# EasyEDA Pro project ProPrj_ROV_MINI_CTRL_2026-11-13.epro, schematic ROV_MINI_CTRL_V1.0.0

## Sheets
1 MCU: Assembly Variant: Basic; Board Name: Board1; Create Date: 2026-05-09; Page Name: MCU; Project Name: ROV_MINI_CTRL; Schematic Name: ROV_MINI_CTRL_V1.0.0; Update Date: 2026-05-09; Company: 嘉立创EDA; Page Size: A3; Version: V1.0
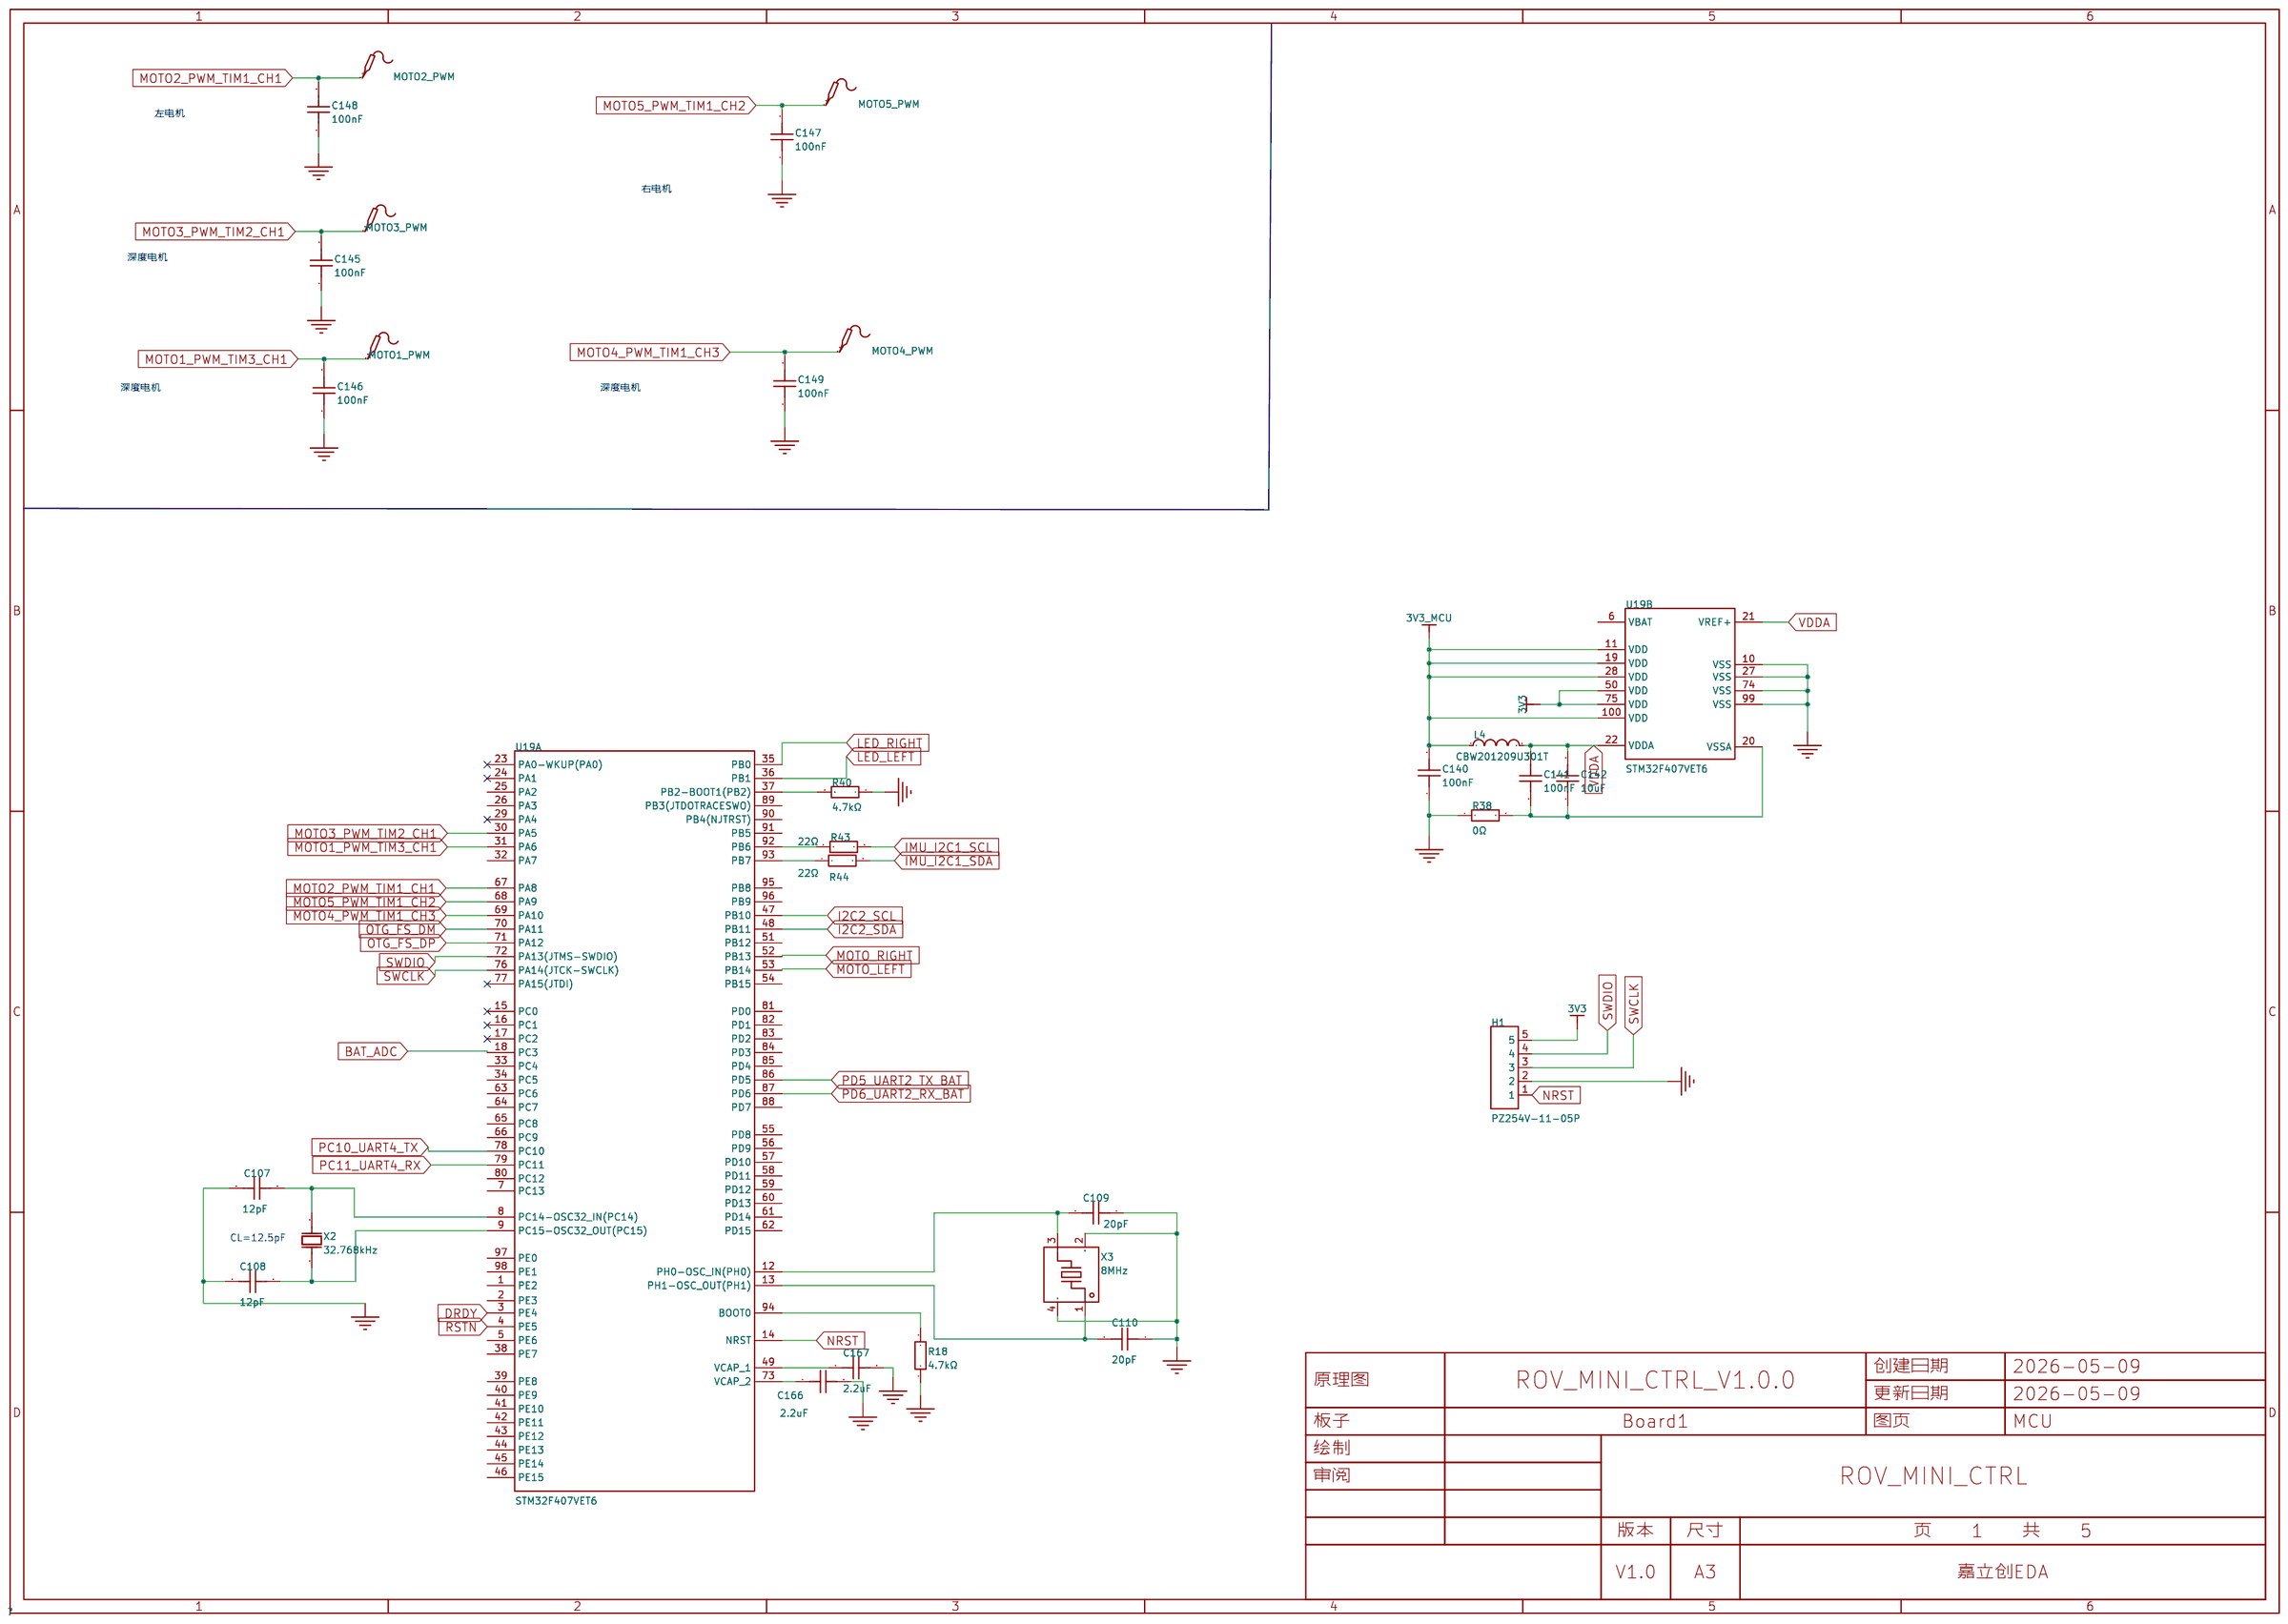
[diagram p7: MCU]
2 USB: Create Date: 2026-11-13; Page Name: USB; Update Date: 2026-11-13
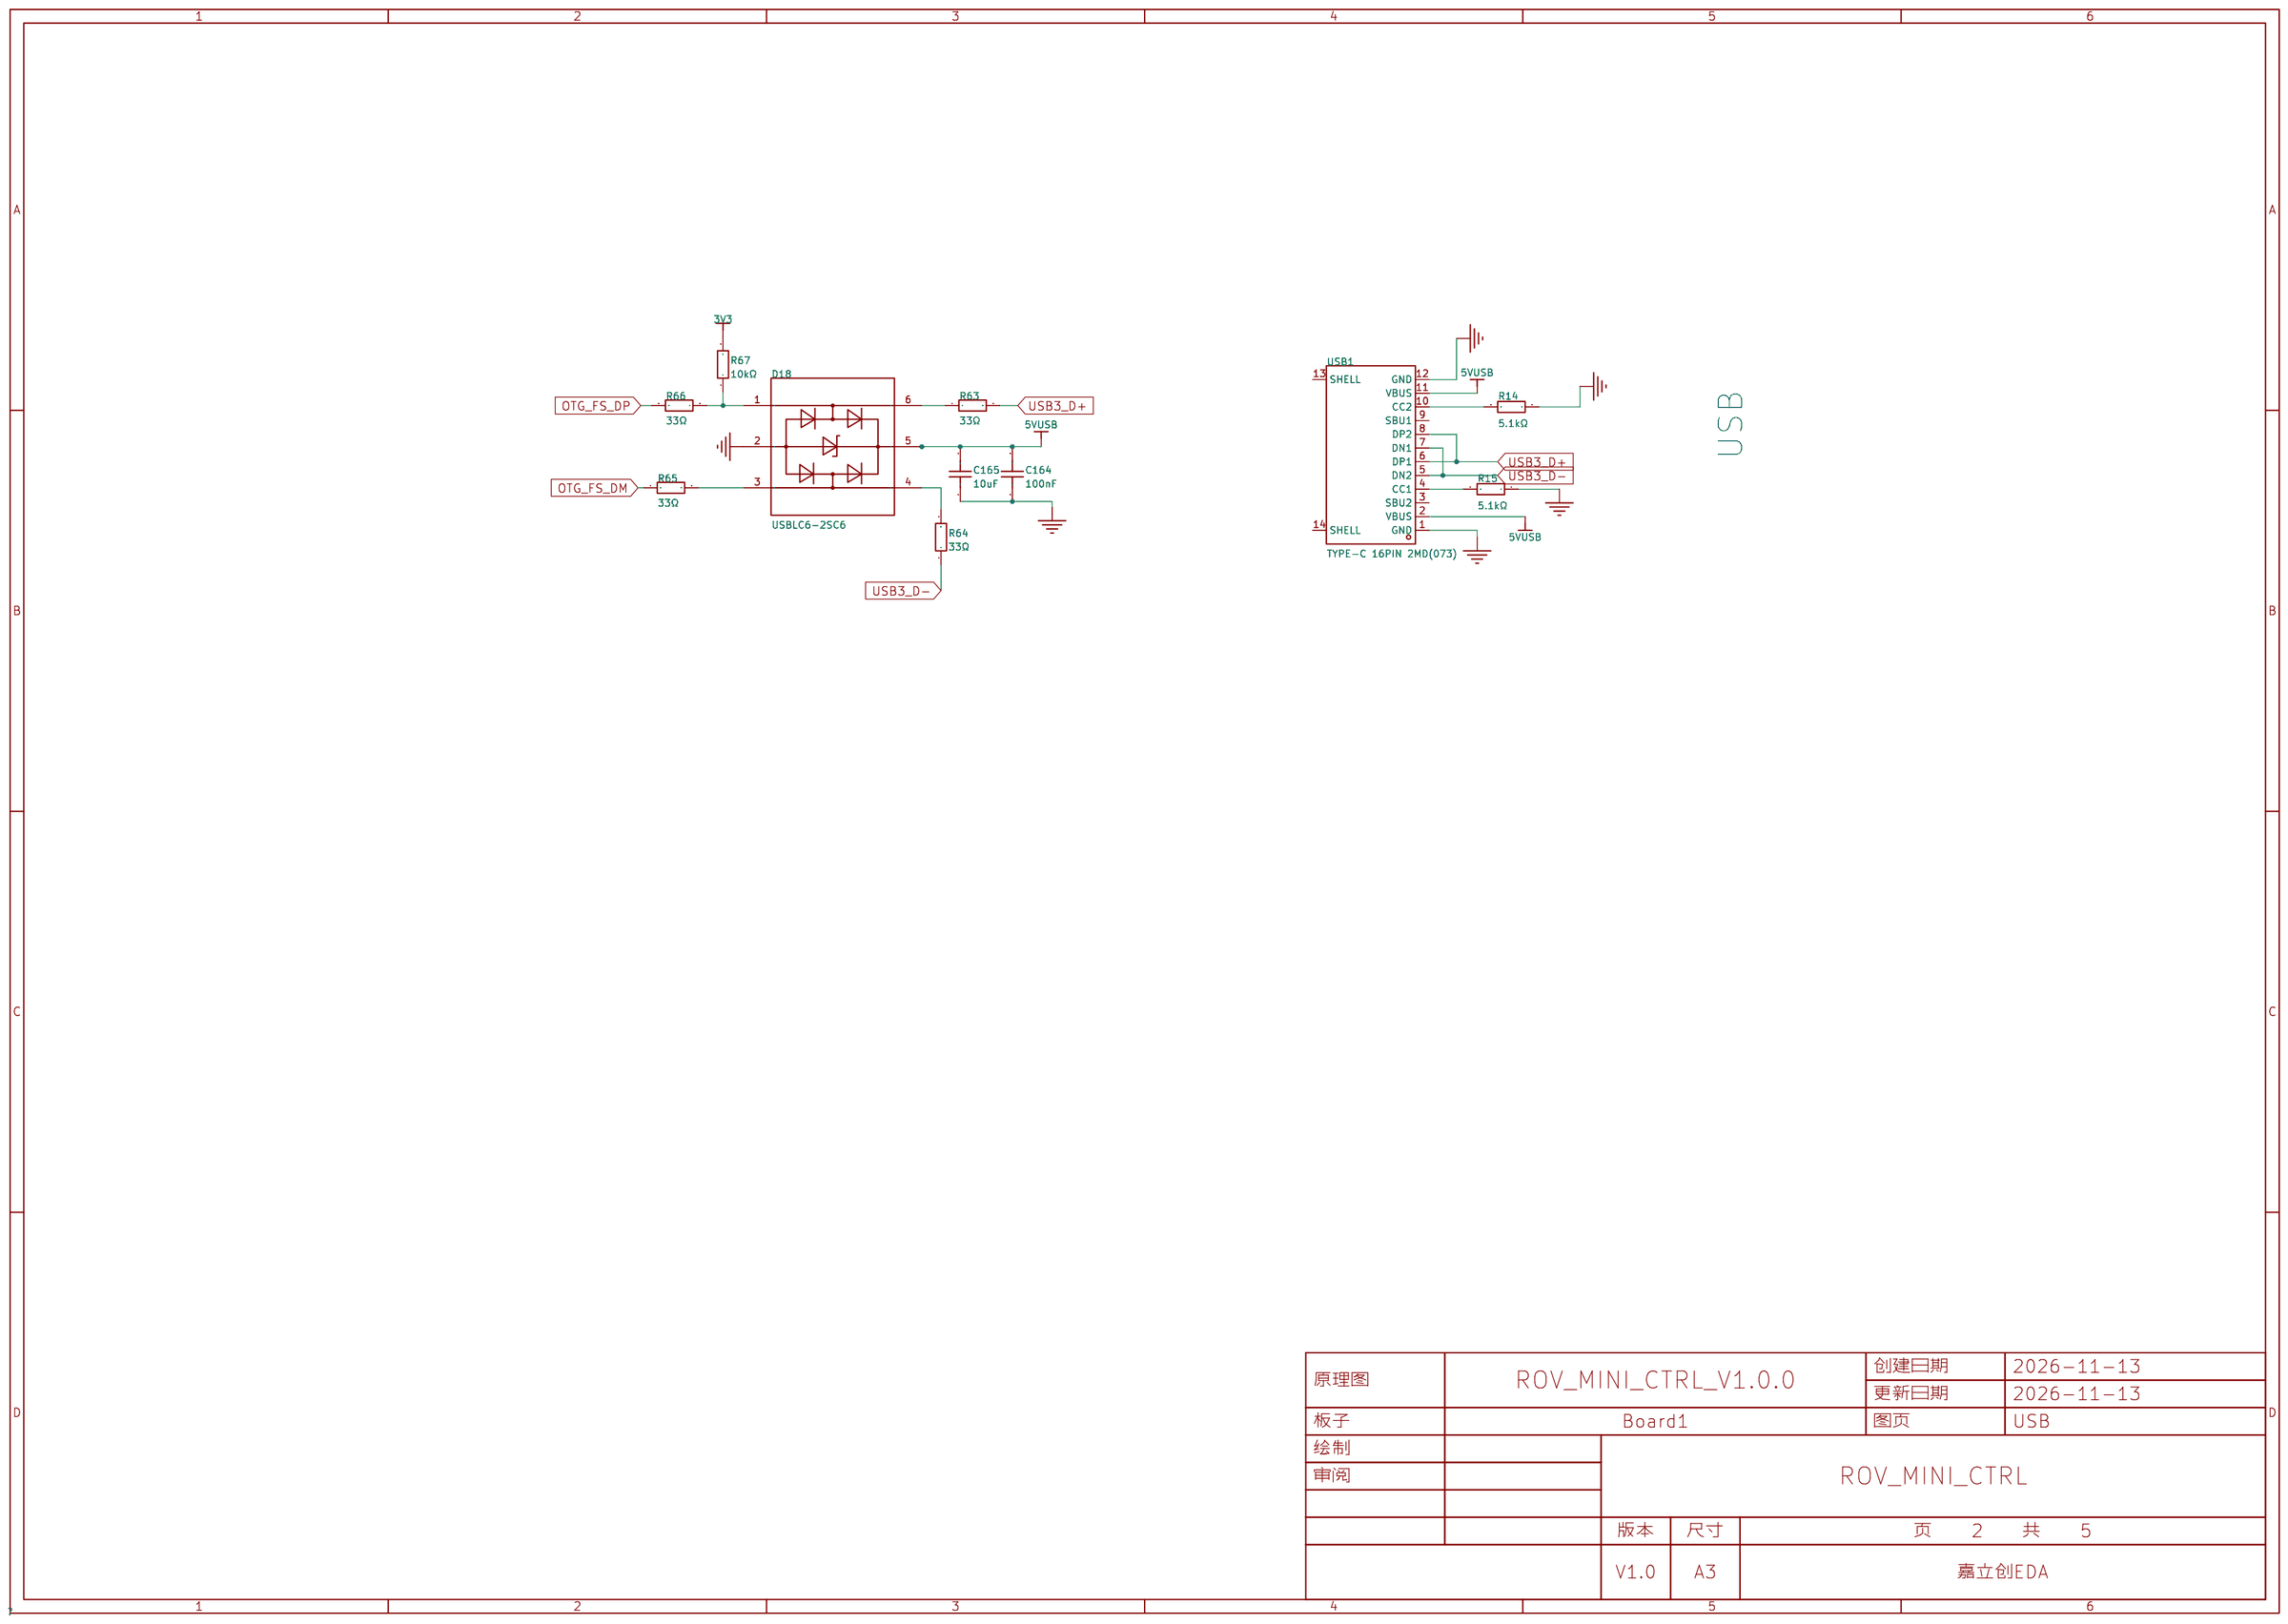
[diagram p8: USB]
3 COM: Page Name: COM
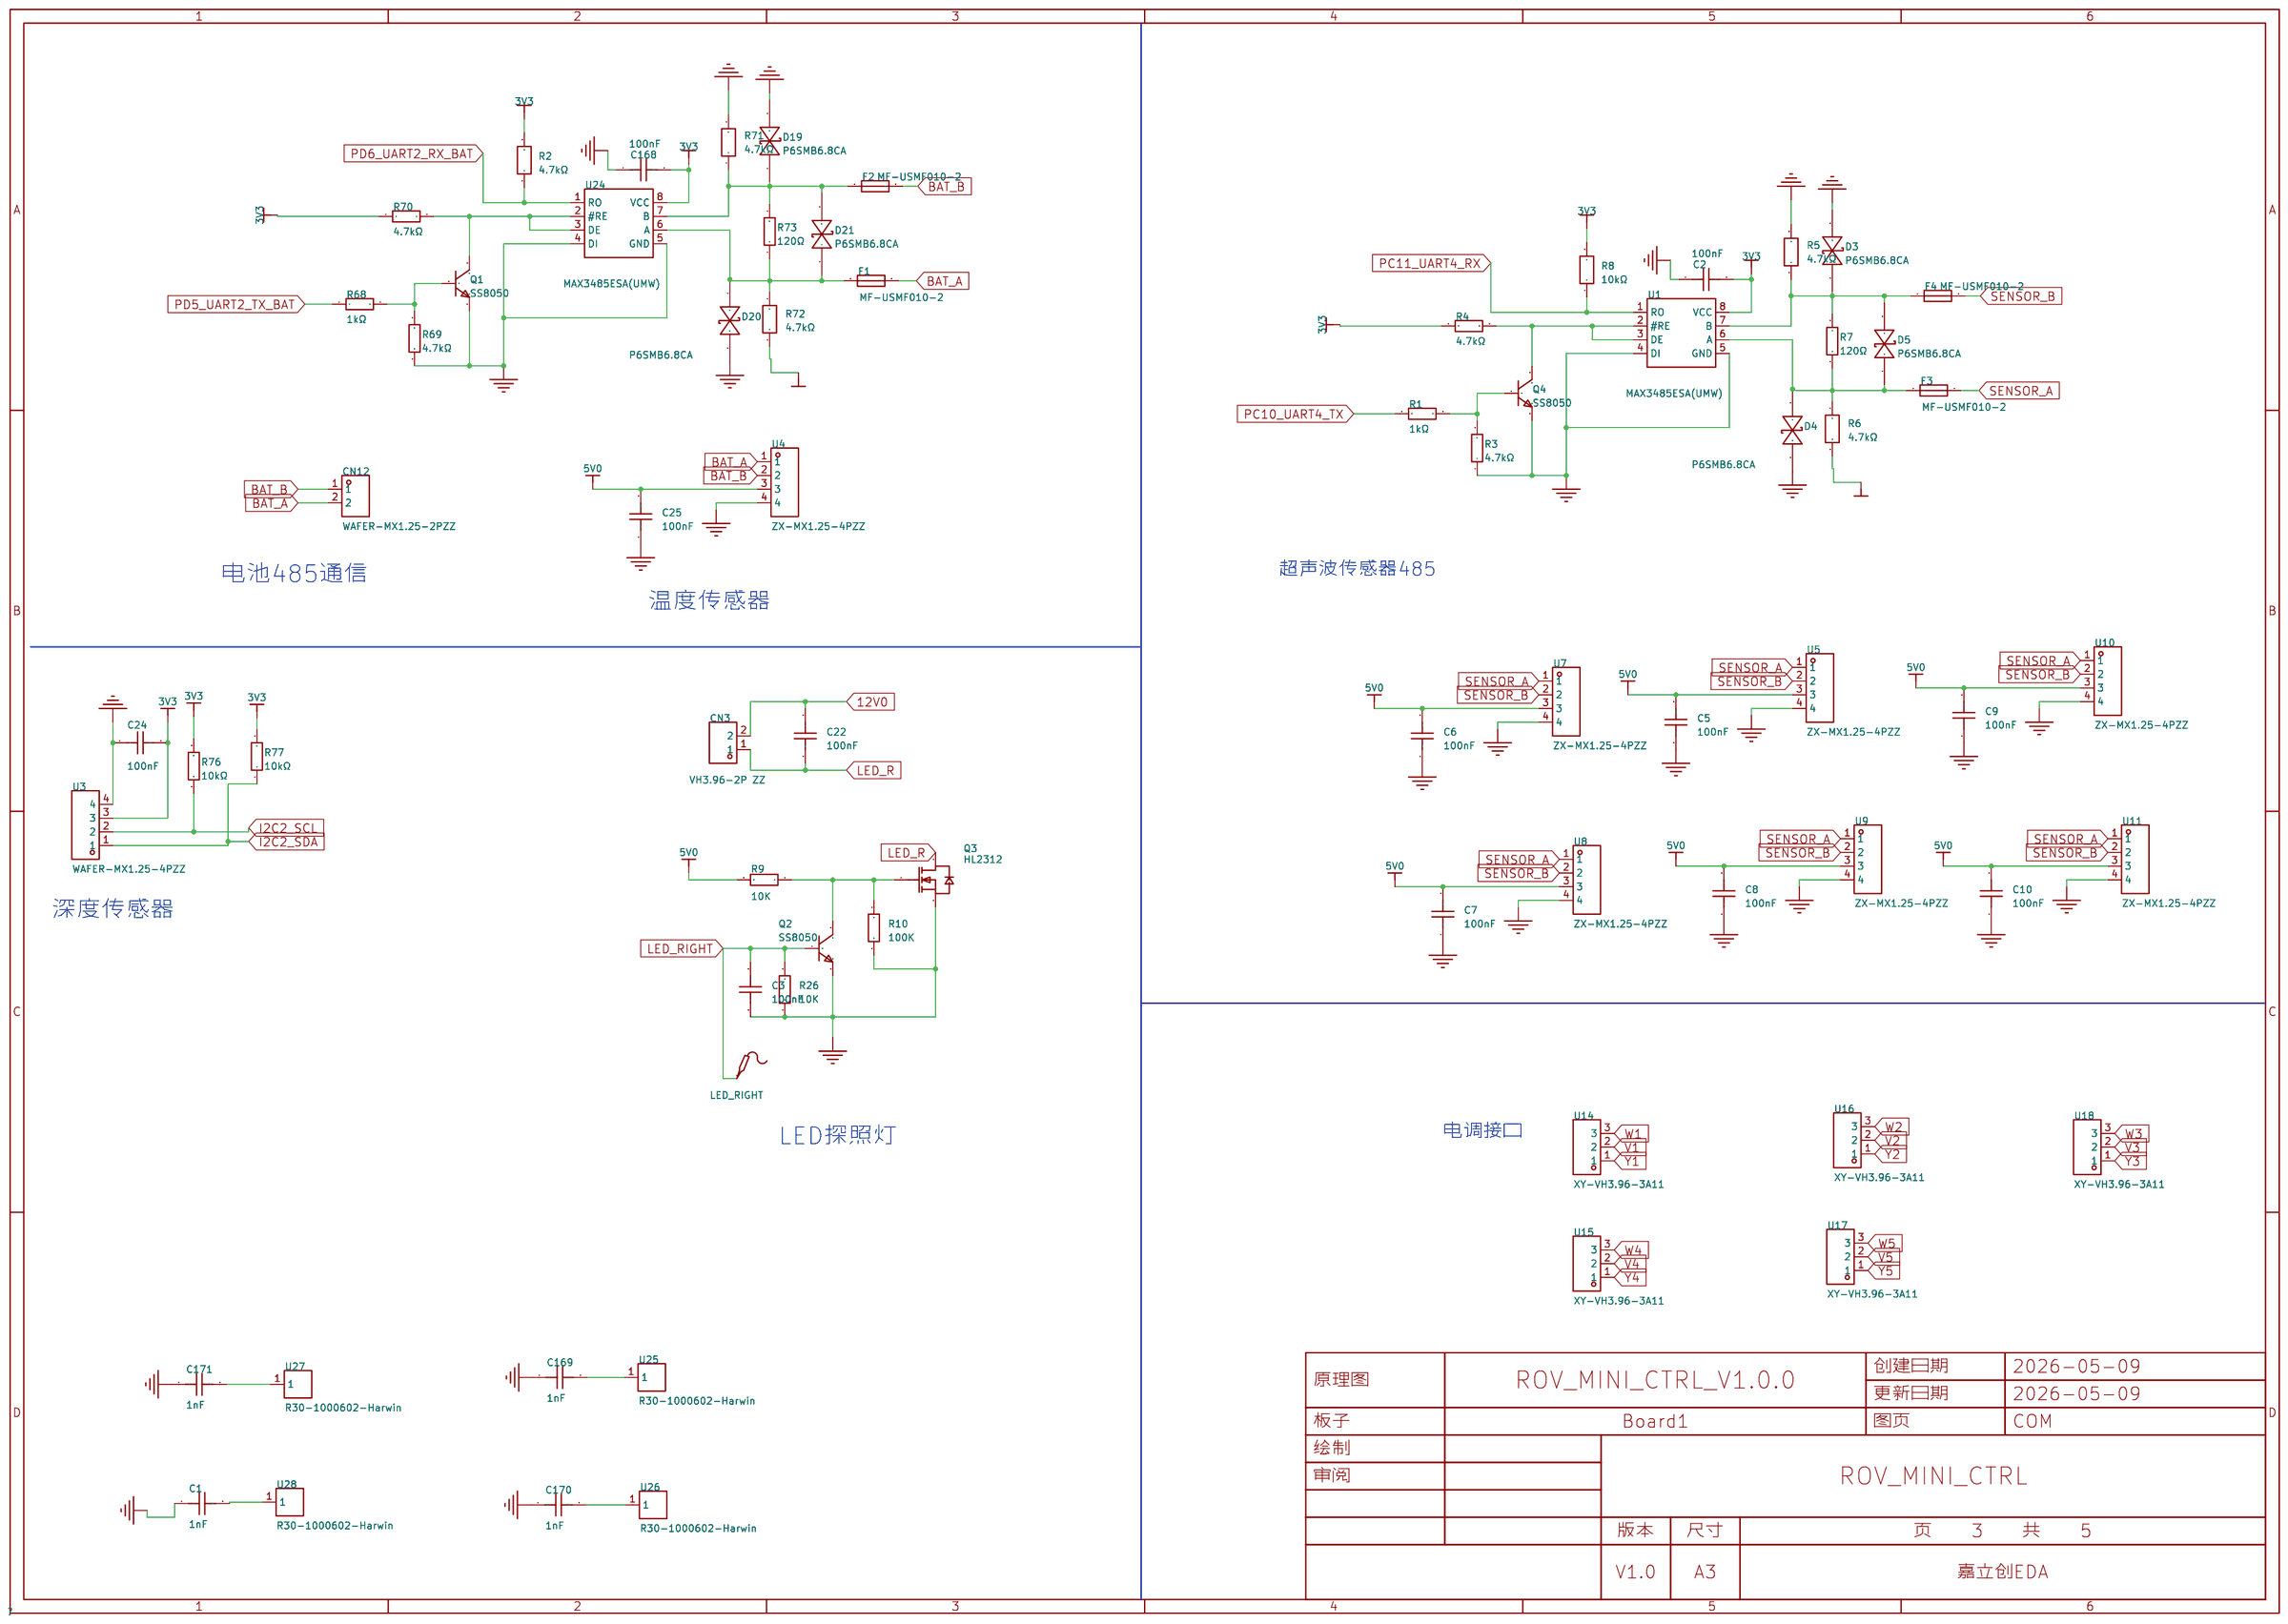
[diagram p9: COM]
4 MOTO: Create Date: 2026-11-13; Page Name: MOTO; Update Date: 2026-11-13
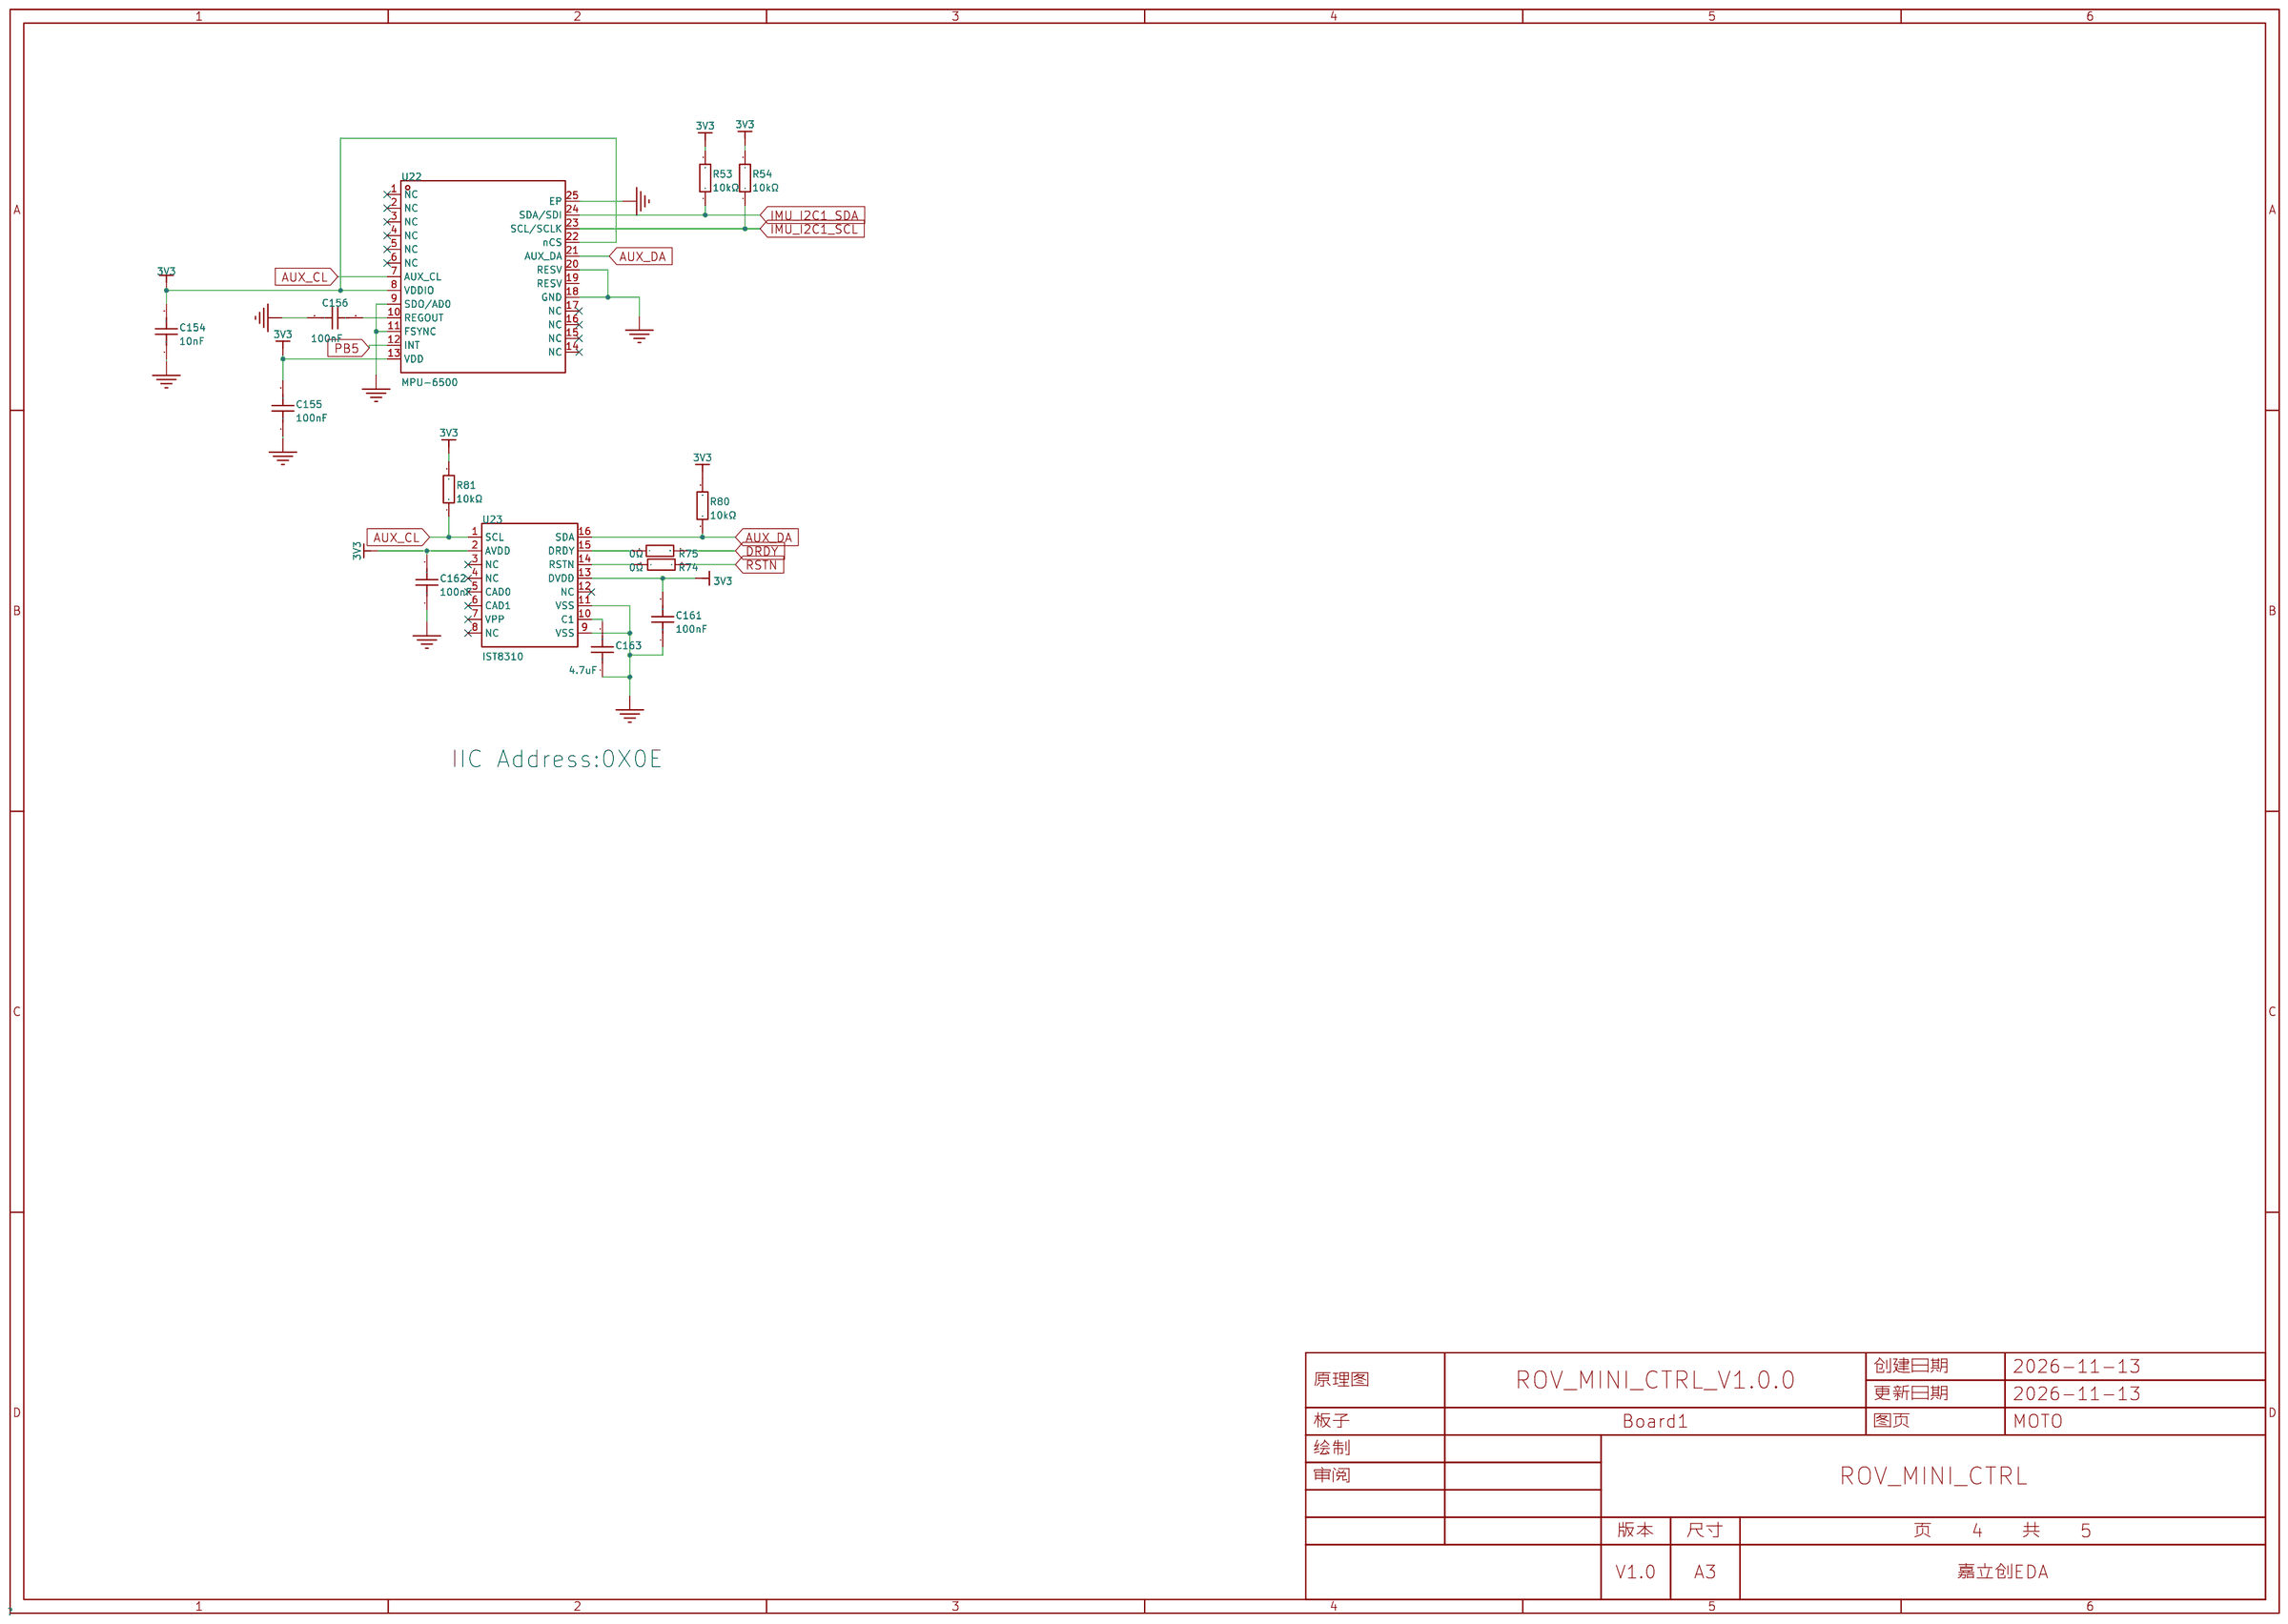
[diagram p10: MOTO]
5 POWER: Page Name: POWER
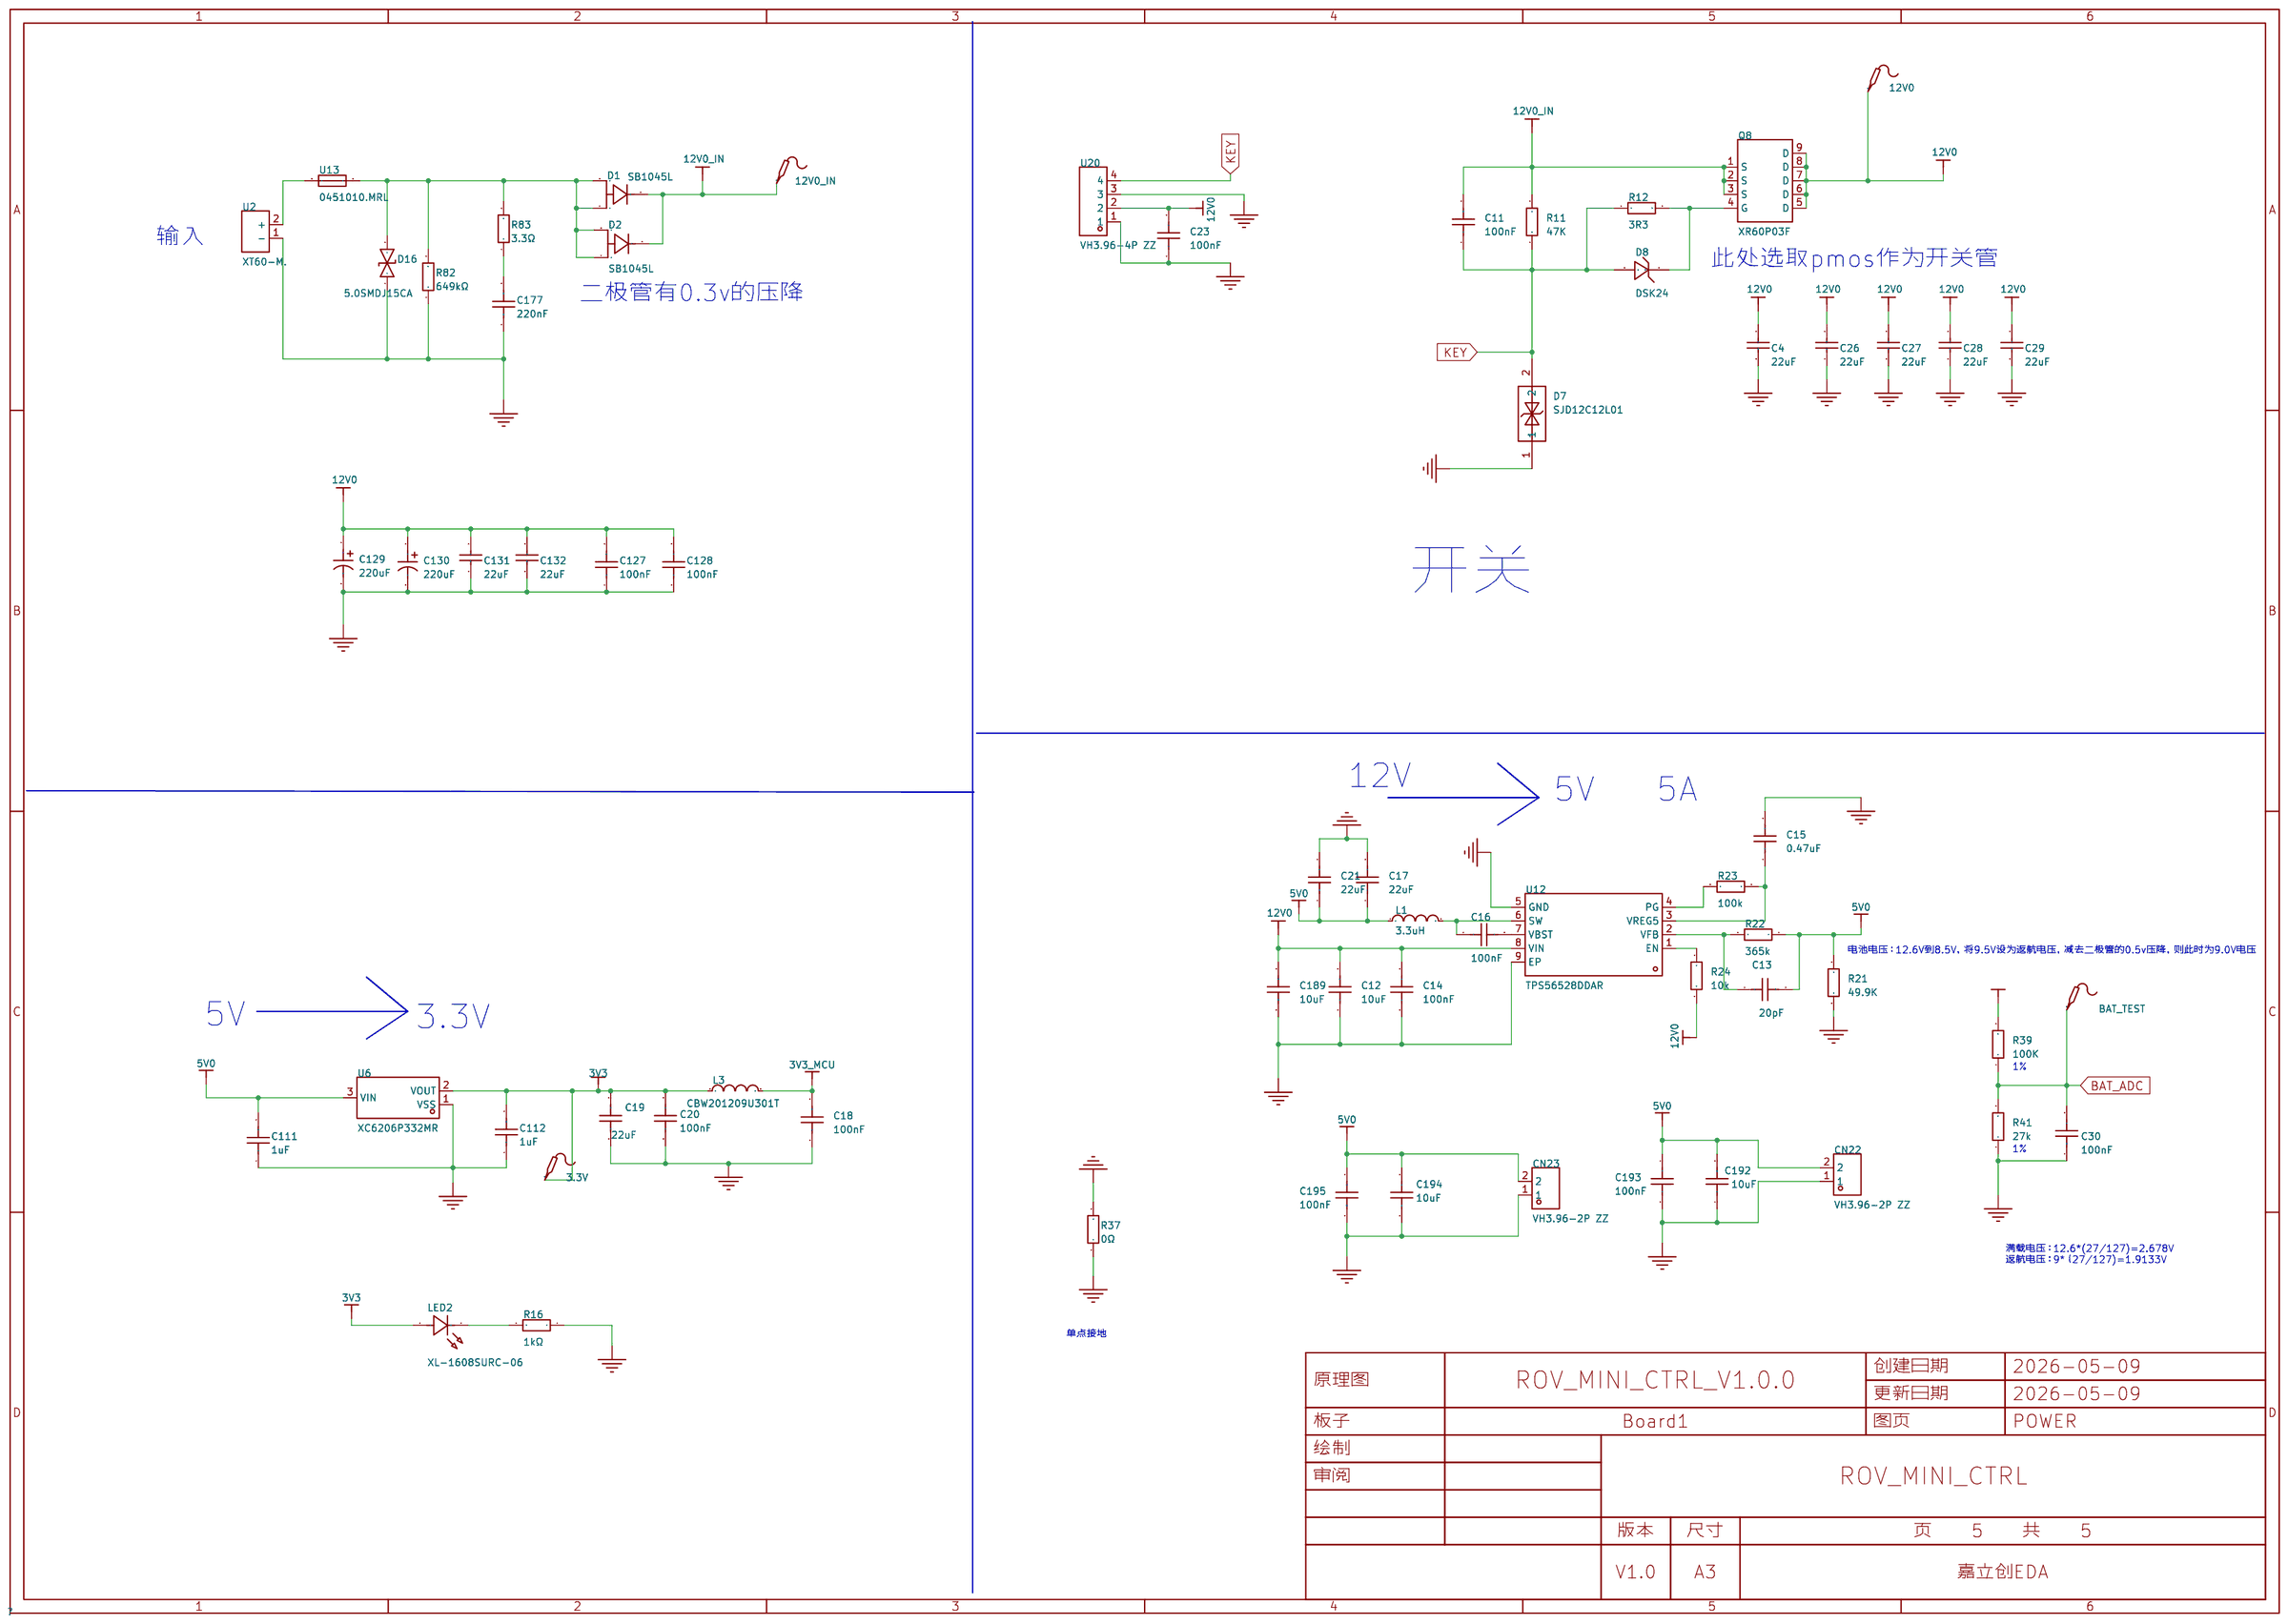
[diagram p11: POWER]

## Parts
sheet COM
C1  1nF  [C1206]
C2  100nF  [C0603]
C3  100nF  [C0603]
C5  100nF  [C0603]
C6  100nF  [C0603]
C7  100nF  [C0603]
C8  100nF  [C0603]
C9  100nF  [C0603]
C10  100nF  [C0603]
C22  100nF  [C0603]
C24  100nF  [C0603]
C25  100nF  [C0603]
C168  100nF  [C0603]
C169  1nF  [C1206]
C170  1nF  [C1206]
C171  1nF  [C1206]
CN3  VH3.96-2P ZZ  [CONN-TH_2P-P3.96_C9900035759]
CN12  WAFER-MX1.25-2PZZ  [CONN-TH_2P-P1.25-V-M_721]
D3  P6SMB6.8CA  [SMB_L4.3-W3.6-LS5.4-BI]
D4  P6SMB6.8CA  [SMB_L4.3-W3.6-LS5.4-BI]
D5  P6SMB6.8CA  [SMB_L4.3-W3.6-LS5.4-BI]
D19  P6SMB6.8CA  [SMB_L4.3-W3.6-LS5.4-BI]
D20  P6SMB6.8CA  [SMB_L4.3-W3.6-LS5.4-BI]
D21  P6SMB6.8CA  [SMB_L4.3-W3.6-LS5.4-BI]
F1  MF-USMF010-2  [F1210]
F2  MF-USMF010-2  [F1210]
F3  MF-USMF010-2  [F1210]
F4  MF-USMF010-2  [F1210]
LED_RIGHT  -  [Test-Point-0.5mm]
Q1  SS8050  [SOT-23_L2.9-W1.3-P1.90-LS2.4-BR]
Q2  SS8050  [SOT-23_L2.9-W1.3-P1.90-LS2.4-BR]
Q3  HL2312  [SOT-23-3_L2.9-W1.3-P1.90-LS2.3-BR]
Q4  SS8050  [SOT-23_L2.9-W1.3-P1.90-LS2.4-BR]
R1  1kΩ  [R0603]
R2  4.7kΩ  [R0603]
R3  4.7kΩ  [R0603]
R4  4.7kΩ  [R0603]
R5  4.7kΩ  [R0603]
R6  4.7kΩ  [R0603]
R7  120Ω  [R0603]
R8  10kΩ  [R0603]
R9  10K  [R0603]
R10  100K  [R0603]
R26  10K  [R0603]
R68  1kΩ  [R0603]
R69  4.7kΩ  [R0603]
R70  4.7kΩ  [R0603]
R71  4.7kΩ  [R0603]
R72  4.7kΩ  [R0603]
R73  120Ω  [R0603]
R76  10kΩ  [R0603]
R77  10kΩ  [R0603]
U1  MAX3485ESA(UMW)  [SOP-8_L5.0-W4.0-P1.27-LS6.0-BL]
U3  WAFER-MX1.25-4PZZ  [CONN-TH_4P-P1.25_WAFER-MX1.25-4PZZ]
U4  ZX-MX1.25-4PZZ  [CONN-TH_4P-P1.25_MEGASTAR_ZX-MX1.25-4PZZ]
U5  ZX-MX1.25-4PZZ  [CONN-TH_4P-P1.25_MEGASTAR_ZX-MX1.25-4PZZ]
U7  ZX-MX1.25-4PZZ  [CONN-TH_4P-P1.25_MEGASTAR_ZX-MX1.25-4PZZ]
U8  ZX-MX1.25-4PZZ  [CONN-TH_4P-P1.25_MEGASTAR_ZX-MX1.25-4PZZ]
U9  ZX-MX1.25-4PZZ  [CONN-TH_4P-P1.25_MEGASTAR_ZX-MX1.25-4PZZ]
U10  ZX-MX1.25-4PZZ  [CONN-TH_4P-P1.25_MEGASTAR_ZX-MX1.25-4PZZ]
U11  ZX-MX1.25-4PZZ  [CONN-TH_4P-P1.25_MEGASTAR_ZX-MX1.25-4PZZ]
U14  XY-VH3.96-3A11  [CONN-TH_3P-P3.96_XYECONN_XY-VH3.96-3A11]
U15  XY-VH3.96-3A11  [CONN-TH_3P-P3.96_XYECONN_XY-VH3.96-3A11]
U16  XY-VH3.96-3A11  [CONN-TH_3P-P3.96_XYECONN_XY-VH3.96-3A11]
U17  XY-VH3.96-3A11  [CONN-TH_3P-P3.96_XYECONN_XY-VH3.96-3A11]
U18  XY-VH3.96-3A11  [CONN-TH_3P-P3.96_XYECONN_XY-VH3.96-3A11]
U24  MAX3485ESA(UMW)  [SOP-8_L5.0-W4.0-P1.27-LS6.0-BL]
U25  R30-1000602-Harwin  [SMD_BD5.0-D3.0]
U26  R30-1000602-Harwin  [SMD_BD5.0-D3.0]
U27  R30-1000602-Harwin  [SMD_BD5.0-D3.0]
U28  R30-1000602-Harwin  [SMD_BD5.0-D3.0]
sheet MCU
C107  12pF  [C0603]
C108  12pF  [C0603]
C109  20pF  [C0603]
C110  20pF  [C0603]
C140  100nF  [C0603]
C141  100nF  [C0603]
C142  10uF  [C0603]
C145  100nF  [C0603]
C146  100nF  [C0603]
C147  100nF  [C0603]
C148  100nF  [C0603]
C149  100nF  [C0603]
C166  2.2uF  [C0603]
C167  2.2uF  [C0603]
H1  PZ254V-11-05P  [HDR-TH_5P-P2.54-V-M]
L4  CBW201209U301T  [L0805]
MOTO1_PWM  -  [Test-Point-0.5mm]
MOTO2_PWM  -  [Test-Point-0.5mm]
MOTO3_PWM  -  [Test-Point-0.5mm]
MOTO4_PWM  -  [Test-Point-0.5mm]
MOTO5_PWM  -  [Test-Point-0.5mm]
R18  4.7kΩ  [R0603]
R38  0Ω  [R0603]
R40  4.7kΩ  [R0603]
R43  22Ω  [R0603]
R44  22Ω  [R0603]
U19  STM32F407VET6  [LQFP-100_L14.0-W14.0-P0.50-LS16.0-BL]  (sections 1,2)
X2  32.768kHz  [CRYSTAL-SMD_L3.2-W1.5-1]
X3  8MHz  [CRYSTAL-SMD_4P-L3.2-W2.5-BL]
sheet MOTO
C154  10nF  [C0603]
C155  100nF  [C0603]
C156  100nF  [C0603]
C161  100nF  [C0603]
C162  100nF  [C0603]
C163  4.7uF  [C0603]
R53  10kΩ  [R0603]
R54  10kΩ  [R0603]
R74  0Ω  [R0603]
R75  0Ω  [R0603]
R80  10kΩ  [R0603]
R81  10kΩ  [R0603]
U22  MPU-6500  [QFN-24_L3.0-W3.0-P0.40-BL-EP]
U23  IST8310  [LGA-16_L3.0-W3.0-P0.50-BL_SQ]
sheet POWER
3.3V  -  [Test-Point-0.5mm]
12V0  -  [Test-Point-0.5mm]
12V0_IN  -  [Test-Point-0.5mm]
BAT_TEST  -  [Test-Point-0.5mm]
C4  22uF  [C1206]
C11  100nF  [C0603]
C12  10uF  [C0603]
C13  20pF  [C0603]
C14  100nF  [C0603]
C15  0.47uF  [C0603]
C16  100nF  [C0603]
C17  22uF  [C0603]
C18  100nF  [C0603]
C19  22uF  [C0603]
C20  100nF  [C0603]
C21  22uF  [C0603]
C23  100nF  [C0603]
C26  22uF  [C1206]
C27  22uF  [C1206]
C28  22uF  [C1206]
C29  22uF  [C1206]
C30  100nF  [C0603]
C111  1uF  [C0603]
C112  1uF  [C0603]
C127  100nF  [C0603]
C128  100nF  [C0603]
C129  220uF  [CAP-SMD_BD6.3-L6.6-W6.6-LS7.2-FD]
C130  220uF  [CAP-SMD_BD6.3-L6.6-W6.6-LS7.2-FD]
C131  22uF  [C1206]
C132  22uF  [C1206]
C177  220nF  [C0603]
C189  10uF  [C0603]
C192  10uF  [C0603]
C193  100nF  [C0603]
C194  10uF  [C0603]
C195  100nF  [C0603]
CN22  VH3.96-2P ZZ  [CONN-TH_2P-P3.96_C9900035759]
CN23  VH3.96-2P ZZ  [CONN-TH_2P-P3.96_C9900035759]
D1  SB1045L  [TO-277_3P-L5.4-W4.0-LS6.5-TR]
D2  SB1045L  [TO-277_3P-L5.4-W4.0-LS6.5-TR]
D7  SJD12C12L01  [SOD-123_L2.8-W1.8-LS3.7-BI]
D8  DSK24  [SOD-123FL_L2.7-W1.8-LS3.8-RD]
D16  5.0SMDJ15CA  [SMC_L6.9-W5.9-LS7.9-BI]
L1  3.3uH  [IND-SMD_L7.0-W6.6]
L3  CBW201209U301T  [L0805]
LED2  XL-1608SURC-06  [LED0603-RD_RED]
Q8  XR60P03F  [DFN5X6-8_L5.9-W5.2-P1.27-LS6.2-BL-EP]
R11  47K  [R0603]
R12  3R3  [R0603]
R16  1kΩ  [R0603]
R21  49.9K  [R0603]
R22  365k  [R0603]
R23  100k  [R0603]
R24  10k  [R0603]
R37  0Ω  [RES-SMD_L6.4-W3.2-A]
R39  100K  [R0603]
R41  27k  [R0603]
R82  649kΩ  [R0603]
R83  3.3Ω  [R0603]
U2  XT60-M.  [CONN-TH_XT60]
U6  XC6206P332MR  [SOT-23-3_L3.0-W1.7-P0.95-LS2.9-BR]
U12  TPS56528DDAR  [SOIC-8_L4.9-W3.9-P1.27-LS6.0-BL-EP]
U13  0451010.MRL  [FUSE-SMD_L6.1-W2.7]
U20  VH3.96-4P ZZ  [CONN-TH_4P-P3.96_HX-VH3.96-4P-ZZ]
sheet USB
C164  100nF  [C0603]
C165  10uF  [C0603]
D18  USBLC6-2SC6  [SOT-23-6_L2.9-W1.6-P0.95-LS2.8-BL]
R14  5.1kΩ  [R0603]
R15  5.1kΩ  [R0603]
R63  33Ω  [R0603]
R64  33Ω  [R0603]
R65  33Ω  [R0603]
R66  33Ω  [R0603]
R67  10kΩ  [R0603]
USB1  TYPE-C 16PIN 2MD(073)  [USB-C-SMD_TYPE-C-6PIN-2MD-073]

## Library data of the parts
C1 C169-C171 = 1206B102K202NT: 容值:1nF;精度:±10%;额定电压:2kV;温度系数:X7R;; LCSC Part Name: 1nF ±10% 2kV; Supplier Part: C9196; Manufacturer: FH(风华); Supplier Footprint: 1206; JLCPCB Part Class: Basic Part; Datasheet: https://atta.szlcsc.com/upload/public/pdf/source/20200305/C486355_26A10D38EF8C2A5C37091D0039909270.pdf; Supplier: LCSC; Tolerance: ±10%; Voltage Rating: 2kV; Temperature Coefficient: X7R
C2 C18 C20 C127 C128 C140 C141 C145-C149 C155 C156 C161 C162 C164 C168 = CGA0603X7R104K500JT: 容值:100nF;精度:±10%;额定电压:50V;温度系数:X7R;; LCSC Part Name: 100nF ±10% 50V; Supplier Part: C6119867; Manufacturer: HRE(芯声); Supplier Footprint: 0603; JLCPCB Part Class: Extended Part; Datasheet: https://atta.szlcsc.com/upload/public/pdf/source/20250103/C44077DA9E7B3EFAE02F22B6D3D1CBC9.pdf; Supplier: LCSC; Tolerance: ±10%; Voltage Rating: 50V; Temperature Coefficient: X7R
C3 C5-C11 C14-C17 C21-C25 C30 = CAP_0603: Supplier Footprint: 0603
CN3 CN22 CN23 = VH3.96-2P ZZ: 插针结构:1x2P;间距:3.96mm;安装方式:直插;参考系列:VH;总PIN数:2P;排数:1;每排PIN数:2;行距:-;额定电流:7A;触头材质:黄铜;触头镀层:锡;工作温度:-25℃~+85℃;; LCSC Part Name: 1x2P 间距:3.96mm 直插 系列:VH; Supplier Part: C5379868; Manufacturer: SHOU HAN(首韩); Supplier Footprint: 插件,P=3.96mm; JLCPCB Part Class: 扩展库; Datasheet: https://item.szlcsc.com/datasheet/VH3.96-2P%2520ZZ/6244976.html; Supplier: LCSC; Pins Structure: 1x2P; Pitch: 3.96mm; Mounting Type: 直插; Reference Series: VH; Number of Pins: 2P; Number of Rows: 1; Number of PINs Per Row: 2; Current Rating: 7A; Contact Material: 黄铜; Contact Plating: 锡; Operating Temperature: -25℃~+85℃; Voltage Rating: 250V; Plastic Material: PA66; Flame Retardant Rating: UL94V-0; Color: 白色
CN12 = WAFER-MX1.25-2PZZ: 插针结构:1x2P;间距:1.25mm;安装方式:直插;参考系列:PicoBlade(MX 1.25);总PIN数:2P;排数:1;每排PIN数:2;行距:-;额定电流:1A;触头材质:黄铜;触头镀层:锡;工作温度:-25℃~+85℃;; LCSC Part Name: 1x2P 间距:1.25mm 直插 系列:PicoBlade(MX 1.25); Supplier Part: C3029395; Manufacturer: XUNPU(讯普); Supplier Footprint: 插件,P=1.25mm; JLCPCB Part Class: 扩展库; Datasheet: https://item.szlcsc.com/datasheet/WAFER-MX1.25-2PZZ/3561407.html; Supplier: LCSC; Pins Structure: 1x2P; Pitch: 1.25mm; Mounting Type: 直插; Reference Series: PicoBlade(MX 1.25); Number of Pins: 2P; Number of Rows: 1; Number of PINs Per Row: 2; Current Rating: 1A; Contact Material: 黄铜; Contact Plating: 锡; Operating Temperature: -25℃~+85℃; Voltage Rating: 125V; Plastic Material: LCP; Flame Retardant Rating: UL94V-0; Color: 米色; Z-Height of the Board: 4.6mm; X-Length of Bottom Edge on Board (Spacing Line): 4.4mm; Y-Width of Bottom Edge on Board: 3.3mm
D3-D5 D19-D21 = P6SMB6.8CA_C2758563: 反向截止电压(Vrwm):5.8V;钳位电压:10.5V;峰值脉冲电流(Ipp):57.1A;击穿电压:6.45V;; Supplier Part: C2758563; Manufacturer: UMW(友台半导体); Supplier Footprint: SMB; JLCPCB Part Class: 扩展库; Datasheet: https://atta.szlcsc.com/upload/public/pdf/source/20220418/9BDF7C7F05B151FF0DC9933F98EB12D8.pdf; Supplier: LCSC; Reverse Stand-Off Voltage (Vrwm): 5.8V; Clamping Voltage: 10.5V; Peak Pulse Current (Ipp): 57.1A; Voltage - Breakdown: 6.45V; Reverse Leakage Current (Ir): 1mA; Type: TVS
F1-F4 = MF-USMF010-2: 耐压(Vmax):30V;最大电流(Imax):-;保持电流(Ihold):-;跳闸电流(Itrip):-;; LCSC Part Name: 30V 100mA 1210自恢复; Supplier Part: C210359; Manufacturer: BOURNS; Supplier Footprint: 1210; JLCPCB Part Class: 扩展库; Datasheet: https://item.szlcsc.com/datasheet/MF-USMF010-2/211706.html; Supplier: LCSC; Voltage - Max: 30V; Resistance - Initial (Ri) (Min): 800mΩ; Resistance - Post Trip (R1) (Max): 15Ω; Operating Temperature: -40℃~+85℃; Length: 3.2mm; Width: 2.5mm
3.3V 12V0_IN LED_RIGHT MOTO1_PWM MOTO2_PWM MOTO3_PWM MOTO4_PWM MOTO5_PWM = Test-Point: Test Point 测试点; Check: false
Q1 Q2 Q4 = SS8050_C431710: 晶体管类型:NPN;集电极电流(Ic):1.5A;集射极击穿电压(Vceo):25V;功率(Pd):300mW;直流电流增益(hFE@Ic,Vce):120@100mA,1V;; LCSC Part Name: NPN 电流:1.5A 耐压:25V (200-350); Supplier Part: C431710; Manufacturer: MDD(辰达半导体); Supplier Footprint: SOT-23; JLCPCB Part Class: 扩展库; Datasheet: https://atta.szlcsc.com/upload/public/pdf/source/20240710/2275D45831FEB988B7478BE0F5F4041C.pdf; Supplier: LCSC; Transistor Type: NPN; Collector Current (Ic): 1.5A; Collector-Emitter Breakdown Voltage (Vceo): 25V; Power Dissipation (Pd): 300mW; DC Current Gain (hFE@Ic,Vce): 120@100mA,1V; Transition Frequency (fT): 100MHz; Collector Cut-Off Current (Icbo): 100nA; Collector-Emitter Saturation Voltage (VCE(sat)@Ic,Ib): 500mV@800mA,80mA; Operating Temperature: -55℃~+150℃
Q3 = HL2312: 数量:-;漏源电压(Vdss):20V;连续漏极电流(Id):5.5A;导通电阻(RDS(on)):19.5mΩ@4.5V;耗散功率(Pd):1.2W;阈值电压(Vgs(th)):620mV@250uA;; LCSC Part Name: N沟道,电流:5.5A,耐压:20V; Supplier Part: C28646272; Manufacturer: R+O(宏嘉诚); Supplier Footprint: SOT-23; JLCPCB Part Class: Extended Part; Datasheet: https://item.szlcsc.com/datasheet/HL2312/30381018.html; Supplier: LCSC; Drain to Source Voltage: 20V; Current - Continuous Drain(Id): 5.5A; RDS(on): 19.5mΩ@4.5V; Pd - Power Dissipation: 1.2W; Gate Threshold Voltage (Vgs(th)): 620mV@250uA; Gate Charge(Qg): 6nC@4.5V; Input Capacitance(Ciss): 418pF; Reverse Transfer Capacitance (Crss@Vds): 70pF; Operating Temperature: -55℃~+150℃; Type: N沟道; Output Capacitance(Coss): 82pF
R1 R16 R68 = 0603WAF1001T5E: 电阻类型:厚膜电阻;阻值:1kΩ;精度:±1%;功率:100mW;工作电压:75V;温度系数:±100ppm/℃;; LCSC Part Name: 1kΩ ±1% 100mW 厚膜电阻; Supplier Part: C21190; Manufacturer: UNI-ROYAL(厚声); Supplier Footprint: 0603; JLCPCB Part Class: Basic Part; Datasheet: https://item.szlcsc.com/datasheet/0603WAF1001T5E/21904.html; Supplier: LCSC; Type: 厚膜电阻; Tolerance: ±1%; Power(Watts): 100mW; Overload Voltage (Max): 75V; Temperature Coefficient: ±100ppm/℃; Operating Temperature Range: -55℃~+155℃; Voltage-Supply(Max): 75V; Operating Temperature: -55℃~+155℃
R2 R5 R6 R18 R40 R71 R72 = FRC0603J472 TS: 电阻类型:厚膜电阻;阻值:4.7kΩ;精度:±5%;功率:100mW;工作电压:75V;温度系数:±100ppm/℃;; LCSC Part Name: 4.7kΩ ±5% 100mW 厚膜电阻; Supplier Part: C2907166; Manufacturer: FOJAN(富捷); Supplier Footprint: 0603; JLCPCB Part Class: Extended Part; Supplier: LCSC; Type: 厚膜电阻; Tolerance: ±5%; Power(Watts): 100mW; Voltage-Supply(Max): 75V; Temperature Coefficient: ±100ppm/℃; Operating Temperature: -55℃~+155℃
R3 R4 R69 R70 = 0603WAF4701T5E: 电阻类型:厚膜电阻;阻值:4.7kΩ;精度:±1%;功率:100mW;工作电压:75V;温度系数:±100ppm/℃;; LCSC Part Name: 4.7kΩ ±1% 100mW 厚膜电阻; Supplier Part: C23162; Manufacturer: UNI-ROYAL(厚声); Supplier Footprint: 0603; JLCPCB Part Class: Basic Part; Datasheet: https://item.szlcsc.com/datasheet/0603WAF4701T5E/23889.html; Supplier: LCSC; Type: 厚膜电阻; Tolerance: ±1%; Power(Watts): 100mW; Voltage-Supply(Max): 75V; Temperature Coefficient: ±100ppm/℃; Operating Temperature: -55℃~+155℃
R7 R73 = 0603WAF1200T5E: 电阻类型:厚膜电阻;阻值:120Ω;精度:±1%;功率:100mW;工作电压:75V;温度系数:±100ppm/℃;; LCSC Part Name: 120Ω ±1% 100mW 厚膜电阻; Supplier Part: C22787; Manufacturer: UNI-ROYAL(厚声); Supplier Footprint: 0603; JLCPCB Part Class: Basic Part; Datasheet: https://item.szlcsc.com/datasheet/0603WAF1200T5E/23514.html; Supplier: LCSC; Type: 厚膜电阻; Tolerance: ±1%; Power(Watts): 100mW; Voltage-Supply(Max): 75V; Temperature Coefficient: ±100ppm/℃; Operating Temperature: -55℃~+155℃
R8 = FRC0603J103 TS: 电阻类型:厚膜电阻;阻值:10kΩ;精度:±5%;功率:100mW;工作电压:75V;温度系数:±100ppm/℃;; LCSC Part Name: 10kΩ ±5% 100mW 厚膜电阻; Supplier Part: C2930027; Manufacturer: FOJAN(富捷); Supplier Footprint: 0603; JLCPCB Part Class: Extended Part; Datasheet: https://item.szlcsc.com/datasheet/FRC0603J103%2520TS/3266960.html; Supplier: LCSC; Type: 厚膜电阻; Tolerance: ±5%; Power(Watts): 100mW; Voltage-Supply(Max): 75V; Temperature Coefficient: ±100ppm/℃; Operating Temperature: -55℃~+155℃
R9-R12 R21-R24 R26 R39 R41 = Res_0603: Supplier Footprint: 0603
R53 R54 R67 R76 R77 R80 R81 = 0603WAF1002T5E: 电阻类型:厚膜电阻;阻值:10kΩ;精度:±1%;功率:100mW;工作电压:75V;温度系数:±100ppm/℃;; LCSC Part Name: 厚膜电阻 10kΩ ±1% 100mW; Supplier Part: C25804; Manufacturer: UNI-ROYAL(厚声); Supplier Footprint: 0603; JLCPCB Part Class: Basic Part; Datasheet: https://item.szlcsc.com/datasheet/0603WAF1002T5E/26547.html; Supplier: LCSC; Type: 厚膜电阻; Tolerance: ±1%; Power(Watts): 100mW; Voltage-Supply(Max): 75V; Temperature Coefficient: ±100ppm/℃; Operating Temperature: -55℃~+155℃
U1 U24 = MAX3485ESA(UMW): 类型:收发器;数据速率:12Mbps;; LCSC Part Name: MAX3485E 3.3V供电，半双工，12Mbps速率，RS485/RS422收发器; Supplier Part: C668204; Manufacturer: UMW(友台半导体); Supplier Footprint: SOP-8; JLCPCB Part Class: 扩展库; Datasheet: https://item.szlcsc.com/datasheet/MAX3485ESA(UMW)/698052.html; Supplier: LCSC; Type: 收发器; Number of Drivers: 1; Number of Receivers: 1; Voltage - Supply: 2.97V~3.63V; Data Rate: 12Mbps; Number of Nodes: 256; Operating Temperature: -40℃~+85℃; Communication Mode: 半双工
U3 = WAFER-MX1.25-4PZZ: 插针结构:1x4P;间距:1.25mm;安装方式:直插;参考系列:PicoBlade(MX 1.25);总PIN数:4P;排数:1;每排PIN数:4;行距:-;额定电流:1A;触头材质:黄铜;触头镀层:锡;工作温度:-25℃~+85℃;; LCSC Part Name: 1x4P 间距:1.25mm 直插 系列:PicoBlade(MX 1.25); Supplier Part: C3029397; Manufacturer: XUNPU(讯普); Supplier Footprint: 插件,P=1.25mm; JLCPCB Part Class: Extended Part; Datasheet: https://item.szlcsc.com/datasheet/WAFER-MX1.25-4PZZ/3561409.html; Supplier: LCSC; Pins Structure: 1x4P; Pitch: 1.25mm; Mounting Type: 直插; Reference Series: PicoBlade(MX 1.25); Number of Pins: 4P; Number of Rows: 1; Number of PINs Per Row: 4; Current Rating: 1A; Contact Material: 黄铜; Contact Plating: 锡; Operating Temperature: -25℃~+85℃; Voltage Rating: 125V; Plastic Material: LCP; Flame Retardant Rating: UL94V-0; Color: 米色; Z-Height of the Board: 4.6mm; X-Length of Bottom Edge on Board (Spacing Line): 6.9mm; Y-Width of Bottom Edge on Board: 3.3mm
U4 U5 U7-U11 = ZX-MX1.25-4PZZ: 插针结构:1x4P;间距:1.25mm;安装方式:直插;参考系列:PicoBlade(MX 1.25);总PIN数:4P;排数:1;每排PIN数:4;行距:-;额定电流:1A;触头材质:黄铜;触头镀层:锡;工作温度:-25℃~+85℃;; LCSC Part Name: 1x4P 间距:1.25mm 直插 系列:PicoBlade(MX 1.25); Supplier Part: C7430460; Manufacturer: Megastar(兆星); Supplier Footprint: 插件,P=1.25mm; JLCPCB Part Class: Extended Part; Datasheet: https://item.szlcsc.com/datasheet/ZX-MX1.25-4PZZ/8430329.html; Supplier: LCSC; Pins Structure: 1x4P; Pitch: 1.25mm; Mounting Type: 直插; Reference Series: PicoBlade(MX 1.25); Number of Pins: 4P; Number of Rows: 1; Number of PINs Per Row: 4; Current Rating: 1A; Contact Material: 黄铜; Contact Plating: 锡; Operating Temperature: -25℃~+85℃; Voltage Rating: 125V; Plastic Material: LCP; Flame Retardant Rating: UL94V-0; Color: 米色; Z-Height of the Board: 4.6mm; X-Length of Bottom Edge on Board (Spacing Line): 6.9mm; Y-Width of Bottom Edge on Board: 3.3mm
U14-U18 = XY-VH3.96-3A11: 插针结构:1x3P;间距:3.96mm;安装方式:直插;总PIN数:3P;排数:1;每排PIN数:3;行距:3.96mm;额定电流:3A;触头材质:黄铜;触头镀层:锡;工作温度:-25℃~+85℃;; LCSC Part Name: 1x3P 间距:3.96mm 直插; Supplier Part: C19271414; Manufacturer: XYECONN(辛译); Supplier Footprint: 插件,P=3.96mm; JLCPCB Part Class: Extended Part; Datasheet: https://item.szlcsc.com/datasheet/XY-VH3.96-3A11/20540923.html; Supplier: LCSC; Pins Structure: 1x3P; Pitch: 3.96mm; Mounting Type: 直插; Number of Pins: 3P; Number of Rows: 1; Number of PINs Per Row: 3; Row Spacing: 3.96mm; Current Rating: 3A; Contact Material: 黄铜; Contact Plating: 锡; Operating Temperature: -25℃~+85℃; Voltage Rating: 250V; Plastic Material: PA66; Flame Retardant Rating: UL94V-0; Y-Width of Bottom Edge on Board: 7.9mm
U25-U28 = R30-1000602-Harwin: LCSC Part Name: HARWIN M3 x 0.5六角黄铜螺母柱,6mm总长,5mm六角对边, R30-1000602 rs1613559; Supplier Part: C47018769; Manufacturer: Harwin; Datasheet: https://item.szlcsc.com/datasheet/R30-1000602-Harwin/49200836.html; Supplier: LCSC
C107 C108 = CC0603JRNPO9BN120: 容值:12pF;精度:±5%;额定电压:50V;温度系数:NP0;; LCSC Part Name: 12pF ±5% 50V; Supplier Part: C107034; Manufacturer: YAGEO(国巨); Supplier Footprint: 0603; JLCPCB Part Class: Extended Part; Datasheet: https://item.szlcsc.com/datasheet/CC0603JRNPO9BN120/108250.html; Supplier: LCSC; Tolerance: ±5%; Voltage Rating: 50V; Temperature Coefficient: NP0
C109 C110 = CC0603JRNPO9BN200: 容值:20pF;精度:±5%;额定电压:50V;材质(温度系数):NP0;; LCSC Part Name: 20pF ±5% 50V; Supplier Part: C105621; Manufacturer: YAGEO(国巨); Supplier Footprint: 0603; JLCPCB Part Class: Extended Part; Datasheet: https://atta.szlcsc.com/upload/public/pdf/source/20170505/1493957838062.pdf; Supplier: LCSC; Tolerance: ±5%; Voltage Rated: 50V; Temperature Coefficient: NP0
C142 C165 = CL10A106MA8NRNC: 容值:10uF;精度:±20%;额定电压:25V;温度系数:X5R;; LCSC Part Name: 10uF ±20% 25V; Supplier Part: C96446; Manufacturer: SAMSUNG(三星); Supplier Footprint: 0603; JLCPCB Part Class: Basic Part; Datasheet: https://item.szlcsc.com/datasheet/CL10A106MA8NRNC/97651.html; Supplier: LCSC; Tolerance: ±20%; Voltage Rating: 25V; Temperature Coefficient: X5R
C166 C167 = CL10A225KO8NNNC: 容值:2.2uF;精度:±10%;额定电压:16V;温度系数:X5R;; LCSC Part Name: 2.2uF ±10% 16V; Supplier Part: C23630; Manufacturer: SAMSUNG(三星); Supplier Footprint: 0603; JLCPCB Part Class: Basic Part; Datasheet: https://item.szlcsc.com/datasheet/CL10A225KO8NNNC/24366.html; Supplier: LCSC; Tolerance: ±10%; Voltage Rating: 16V; Temperature Coefficient: X5R
H1 = PZ254V-11-05P: 插针结构:1x5P;间距:2.54mm;行距:-;圆针/方针:方针;安装方式:直插;排数:单排;总PIN位数:5P;额定电流:-;额定电压:-;配合针长度:6mm;塑高:2.5mm;端接针长度:3mm;触头材质:黄铜;触头镀层:-;工作温度:-40℃~+105℃;颜色:黑色;; LCSC Part Name: 1x5P 间距:2.54mm 方针 直插; Supplier Part: C492404; Manufacturer: XFCN(兴飞); Supplier Footprint: 插件,P=2.54mm; JLCPCB Part Class: 扩展库; Datasheet: https://atta.szlcsc.com/upload/public/pdf/source/20200309/C492404_E51533260F8710EFF5D4617281164C1D.pdf; Supplier: LCSC; Pin Structure: 1x5P; Pitch: 2.54mm; Circluar Pins/Square Pins: 方针; Mounting Type: 直插; Number of Rows: 单排; Number of Pins: 5P; Length of Mating Pin: 6mm; Insulation Height: 2.5mm; Length of End Connection Pin: 3mm; Contact Material: 黄铜; Operating Temperature: -40℃~+105℃; Color: 黑色
L3 L4 = CBW201209U301T: 阻抗@频率:300Ω@100MHz;误差:±25%;直流电阻(DCR):200mΩ;; LCSC Part Name: 单路 0805磁珠 阻抗300Ω@100MHz; Supplier Part: C67451; Manufacturer: FH(风华); Supplier Footprint: 0805; JLCPCB Part Class: 扩展库; Datasheet: https://atta.szlcsc.com/upload/public/pdf/source/20171113/C141982_15105613387721115830.pdf; Supplier: LCSC; Impedance @ Frequency: 300Ω@100MHz; Tolerance: ±25%; DC Resistance(DCR): 200mΩ; Current Rating: 2A; Number of Circuits: 1
R38 = FRC0603F0000TS: 电阻类型:厚膜电阻;阻值:0Ω;精度:±1%;功率:100mW;工作电压:75V;; LCSC Part Name: 0Ω ±1% 100mW 厚膜电阻; Supplier Part: C2906974; Manufacturer: FOJAN(富捷); Supplier Footprint: 0603; JLCPCB Part Class: Extended Part; Supplier: LCSC; Type: 厚膜电阻; Tolerance: ±1%; Power(Watts): 100mW; Voltage-Supply(Max): 75V; Operating Temperature: -55℃~+155℃
R43 R44 = 0603WAF220JT5E: 电阻类型:厚膜电阻;阻值:22Ω;精度:±1%;功率:100mW;最大工作电压:75V;温度系数:±100ppm/℃;; LCSC Part Name: 22Ω ±1% 100mW 厚膜电阻; Supplier Part: C23345; Manufacturer: UNI-ROYAL(厚声); Supplier Footprint: 0603; JLCPCB Part Class: Basic Part; Datasheet: https://atta.szlcsc.com/upload/public/pdf/source/20200306/C422600_1E6D84923E4A46A82E41ADD87F860B5C.pdf; Supplier: LCSC; Type: 厚膜电阻; Tolerance: ±1%; Power(Watts): 100mW; Overload Voltage (Max): 75V; Temperature Coefficient: ±100ppm/℃; Operating Temperature Range: -55℃~+155℃
U19 = STM32F407VET6: CPU内核:ARM-M4;CPU最大主频:168MHz;应用领域:-;; LCSC Part Name: 带DSP和FPU的高性能基础系列ARM Cortex-M4 MCU，具有512 KB Flash、168 MHz CPU、ART加速器、以太网和FSMC; Supplier Part: C28730; Manufacturer: ST(意法半导体); Supplier Footprint: LQFP-100(14x14); JLCPCB Part Class: 扩展库; Datasheet: https://item.szlcsc.com/datasheet/STM32F407VET6/29482.html; Supplier: LCSC; CPU Core: ARM-M4; CPU Maximum Speed: 168MHz; Program Storage Size: 512KB; Program Memory Type: FLASH; Number of I/O: 82; ADC (Bit): 12bit; DAC (Bit): 12bit; Voltage - Supply: 1.8V~3.6V
X2 = XKXGI-SUA-32.768K: 晶振类型:贴片晶振;频率:32.768kHz;常温频差:±20ppm;负载电容:12.5pF;频率稳定度:±30ppm;; LCSC Part Name: YST310S 32.768KHZ 2P 3215 12.5PF ±20PPM -40~85℃; Supplier Part: C5213671; Manufacturer: YXC(扬兴晶振); Supplier Footprint: SMD3215-2P; JLCPCB Part Class: 扩展库; Datasheet: https://item.szlcsc.com/datasheet/XKXGI-SUA-32.768K/5908943.html; Supplier: LCSC; Type: 贴片晶振; Normal temperature Frequency Tolerance: ±20ppm; Load Capacitance: 12.5pF; Frequency Stability: ±30ppm; Operating Temperature: -40℃~+85℃
X3 = X32258MSB4SI: 晶振类型:贴片晶振;频率:8MHz;常温频差:±10ppm;负载电容:20pF;频率稳定度:±20ppm;; LCSC Part Name: YSX321SL 8MHZ 4P 3225 20PF ±10PPM -40~85℃ (±20PPM); Supplier Part: C2682774; Manufacturer: YXC(扬兴晶振); Supplier Footprint: SMD3225-4P; JLCPCB Part Class: 扩展库; Datasheet: https://item.szlcsc.com/datasheet/X32258MSB4SI/2777871.html; Supplier: LCSC; Type: 贴片晶振; Normal temperature Frequency Tolerance: ±10ppm; Load Capacitance: 20pF; Frequency Stability: ±20ppm; Equivalent Series Resistance(ESR): 120Ω; Operating Temperature: -40℃~+85℃
C154 = CC0603KRX7R9BB103: 容值:10nF;精度:±10%;额定电压:50V;温度系数:X7R;; LCSC Part Name: 10nF ±10% 50V; Supplier Part: C100042; Manufacturer: YAGEO(国巨); Supplier Footprint: 0603; JLCPCB Part Class: Extended Part; Datasheet: https://item.szlcsc.com/datasheet/CC0603KRX7R9BB103/101256.html; Supplier: LCSC; Tolerance: ±10%; Voltage Rating: 50V; Temperature Coefficient: X7R
C163 = CGA0603X5R475K250JT: 容值:4.7uF;精度:±10%;额定电压:25V;温度系数:X5R;; LCSC Part Name: 4.7uF ±10% 25V; Supplier Part: C6119856; Manufacturer: HRE(芯声); Supplier Footprint: 0603; JLCPCB Part Class: Extended Part; Supplier: LCSC; Tolerance: ±10%; Voltage Rating: 25V; Temperature Coefficient: X5R
R74 R75 = 0603WAF0000T5E: 电阻类型:厚膜电阻;阻值:0Ω;精度:±1%;功率:100mW;工作电压:75V;温度系数:-;; LCSC Part Name: 0Ω ±1% 100mW 厚膜电阻; Supplier Part: C21189; Manufacturer: UNI-ROYAL(厚声); Supplier Footprint: 0603; JLCPCB Part Class: 基础库; Datasheet: https://item.szlcsc.com/datasheet/0603WAF0000T5E/21903.html; Supplier: LCSC; Type: 厚膜电阻; Tolerance: ±1%; Power(Watts): 100mW; Voltage-Supply(Max): 75V; Operating Temperature: -55℃~+155℃
U22 = MPU-6500_C50278: 传感器类型:加速度计陀螺仪;接口类型:I2C；SPI;; Supplier Part: C50278; Manufacturer: TDK InvenSense(应美盛); Supplier Footprint: QFN-24-EP(3x3); JLCPCB Part Class: 扩展库; Datasheet: https://item.szlcsc.com/datasheet/MPU-6500/51287.html; Supplier: LCSC; Accelerometer Sensing Axis: X,Y,Z; Acceleration Measurement Range (MAX): ±16g; Gyroscope Sensing Axis: X,Y,Z; Gyroscope Measurement Range (MAX): ±2000dps; Sensor Type: 加速度计陀螺仪; Output Bits: 16bit; Interface: I2C；SPI; Standby Current: 6uA; Operating Temperature: -40℃~+85℃
U23 = IST8310_C2683055: IST8310是一款三轴数字磁力计，采用3.0x3.0x1.0mm³、16引脚LGA封装。它是一款集成芯片，集成了三轴磁传感器、数字控制逻辑、内置温度补偿电路和自测试功能; LCSC Part Name: 三维磁力计; Supplier Part: C2683055; Manufacturer: iSentek(爱盛科技); Supplier Footprint: LGA-16(3x3); JLCPCB Part Class: 扩展库; Datasheet: https://item.szlcsc.com/datasheet/IST8310/2778854.html; Supplier: LCSC; Magnetic Sensing Range(X,Y): ±1.6mT; Magnetic Sensing Range(Z): ±2.5mT; Output bit: 14bit; Interface Type: I2C; Current - Supply: 600uA; Operating Temperature: -40℃~+85℃
12V0 BAT_TEST = Test-Point: Test Point 测试点
C4 C26-C29 C131 C132 = CL31A226KAHNNNE: 容值:22uF;精度:±10%;额定电压:25V;温度系数:X5R;; LCSC Part Name: 22uF ±10% 25V; Supplier Part: C12891; Manufacturer: SAMSUNG(三星); Supplier Footprint: 1206; JLCPCB Part Class: 基础库; Datasheet: https://item.szlcsc.com/datasheet/CL31A226KAHNNNE/13537.html; Supplier: LCSC; Tolerance: ±10%; Voltage Rating: 25V; Temperature Coefficient: X5R
C12 C189 C192-C195 = CAP_0603: Supplier Footprint: 0603; Sim Model: eb8db00cf755486a99d82f511adf71ce; Sim Model Title: Capacitor; Sim Model Path: 0819f05c4eef4c71ace90d822a990e87; NGSpice Model: b0400270a9e64a8faba05adf23a90584; NGSpice Model Title: Capacitor; NGspice Model Path: 0819f05c4eef4c71ace90d822a990e87
C13 = FCC0603N5R0C500CT: 容值:5pF;额定电压:50V;温度系数:C0G;; LCSC Part Name: ±0.25pF 5pF 50V; Supplier Part: C5137626; Manufacturer: FOJAN(富捷); Supplier Footprint: 0603; JLCPCB Part Class: Extended Part; Datasheet: https://item.szlcsc.com/datasheet/FCC0603N5R0C500CT/5747078.html; Supplier: LCSC; Voltage Rating: 50V; Temperature Coefficient: C0G
C19 = CL10A226MQ8NRNC: 容值:22uF;精度:±20%;额定电压:6.3V;温度系数:X5R;; LCSC Part Name: 22uF ±20% 6.3V; Supplier Part: C59461; Manufacturer: SAMSUNG(三星); Supplier Footprint: 0603; JLCPCB Part Class: Basic Part; Datasheet: https://item.szlcsc.com/datasheet/CL10A226MQ8NRNC/60514.html; Supplier: LCSC; Tolerance: ±20%; Voltage Rating: 6.3V; Temperature Coefficient: X5R
C111 C112 = CGA0603X5R105K500JT: 容值:1uF;精度:±10%;额定电压:50V;温度系数:X5R;; LCSC Part Name: 1uF ±10% 50V; Supplier Part: C6119852; Manufacturer: HRE(芯声); Supplier Footprint: 0603; JLCPCB Part Class: Extended Part; Supplier: LCSC; Tolerance: ±10%; Voltage Rating: 50V; Temperature Coefficient: X5R
C129 C130 = RVT1C221M0607 220UF 16V: 容值:220uF;精度:±20%;额定电压:16V;纹波电流:110mA@120Hz;等效串联电阻(ESR):-;; LCSC Part Name: 220uF ±20% 16V; Supplier Part: C970695; Manufacturer: DMBJ(振宝佳); Supplier Footprint: SMD,D6.3xL7.7mm; JLCPCB Part Class: 扩展库; Datasheet: https://item.szlcsc.com/datasheet/RVT1C221M0607%2520220UF%252016V/1060423.html; Supplier: LCSC; Tolerance: ±20%; Voltage Rating: 16V; Ripple Current: 110mA@120Hz; Diameter: 6.3mm; Height - Seated (Max): 7.7mm; Lifetime: 2000hrs@105℃; Operating Temperature: -55℃~+105℃
C177 = FCC0603B224K500CT: 容值:220nF;精度:±10%;额定电压:50V;温度系数:X7R;; LCSC Part Name: ±0.25pF 220nF ±10% 50V; Supplier Part: C5137500; Manufacturer: FOJAN(富捷); Supplier Footprint: 0603; JLCPCB Part Class: Extended Part; Datasheet: https://item.szlcsc.com/datasheet/FCC0603B224K500CT/5747002.html; Supplier: LCSC; Tolerance: ±10%; Voltage Rating: 50V; Temperature Coefficient: X7R
D1 D2 = SB1045L_C908747: 二极管配置:独立式;正向压降(Vf):530mV@10A;直流反向耐压(Vr):45V;整流电流:10A;; LCSC Part Name: 电压:45V 电流:10A; Supplier Part: C908747; Manufacturer: GOODWORK(固得沃克); Supplier Footprint: TO-277; JLCPCB Part Class: 扩展库; Datasheet: https://item.szlcsc.com/datasheet/SB1045L/975499.html; Supplier: LCSC; Diode Configuration: 独立式; Voltage - Forward(Vf@If): 530mV@10A; Voltage - DC Reverse(Vr): 45V; Current - Rectified: 10A; Reverse Leakage Current (Ir): 150uA; Non-Repetitive Peak Forward Surge Current: 150A
D7 = SJD12C12L01: 极性:双向;反向截止电压(Vrwm):12V;钳位电压:19.9V;峰值脉冲电流(Ipp):10.1A;峰值脉冲功率(Ppp):1kW@8/20us;击穿电压:13.3V;; LCSC Part Name: 双向ESD 12V截止 峰值脉冲电流：10.1A; Supplier Part: C313270; Manufacturer: Brightking(君耀电子); Supplier Footprint: SOD-123S; JLCPCB Part Class: Extended Part; Datasheet: https://item.szlcsc.com/datasheet/SJD12C12L01/295826.html; Supplier: LCSC; Polarity: 双向; Reverse Stand-Off Voltage (Vrwm): 12V; Clamping Voltage: 19.9V; Peak Pulse Current (Ipp): 10.1A; Peak Pulse Power Dissipation (Ppp): 1kW@8/20us; Voltage - Breakdown: 13.3V; Reverse Leakage Current (Ir): 1uA; Number of Channels: 单路; Operating Temperature: -55℃~+150℃; level of protection: IEC 61000-4-2; Type: ESD
D8 = DSK24_C22466352: 二极管配置:独立式;正向压降(Vf):550mV@2A;直流反向耐压(Vr):40V;整流电流:2A;; LCSC Part Name: 电压:40V 电流:2A; Supplier Part: C22466352; Manufacturer: R+O(宏嘉诚); Supplier Footprint: SOD-123FL; JLCPCB Part Class: Extended Part; Datasheet: https://item.szlcsc.com/datasheet/DSK24/24165511.html; Supplier: LCSC; Diode Configuration: 独立式; Voltage - Forward(Vf@If): 550mV@2A; Voltage - DC Reverse(Vr): 40V; Current - Rectified: 2A; Reverse Leakage Current (Ir): 500uA@40V; Operating Junction Temperature Range: -55℃~+125℃; Non-Repetitive Peak Forward Surge Current: 50A
D16 = 5.0SMDJ15CA_C42394444: 极性:双向;反向截止电压(Vrwm):15V;钳位电压:24.4V;峰值脉冲电流(Ipp):204.9A@10/1000us;峰值脉冲功率(Ppp):5kW@10/1000us;击穿电压:18.5V;; LCSC Part Name: 双向TVS 15V截止 峰值浪涌电流：204.9A@10/1000us; Supplier Part: C42394444; Manufacturer: R+O(宏嘉诚); Supplier Footprint: DO-214AB(SMC); JLCPCB Part Class: 扩展库; Datasheet: https://item.szlcsc.com/datasheet/5.0SMDJ15CA/44336002.html; Supplier: LCSC; Polarity: 双向; Reverse Stand-Off Voltage (Vrwm): 15V; Clamping Voltage: 24.4V; Peak Pulse Current (Ipp): 204.9A@10/1000us; Peak Pulse Power Dissipation (Ppp): 5kW@10/1000us; Voltage - Breakdown: 18.5V; Reverse Leakage Current (Ir): 100uA; Operating Temperature: -55℃~+150℃; level of protection: IEC 61000-4-2; Type: TVS
L1 = FXL0630-3R3-M: 电感值:3.3uH;精度:±20%;额定电流:8.5A;饱和电流(Isat):9.5A;类型:一体成型电感;; LCSC Part Name: 3.3uH ±20% 9.5A; Supplier Part: C167219; Manufacturer: cjiang(长江微电); Supplier Footprint: SMD,6.6x7mm; JLCPCB Part Class: Extended Part; Datasheet: https://atta.szlcsc.com/upload/public/pdf/source/20240426/3189EA8206330E2108542F9E34E540E7.pdf; Supplier: LCSC; Tolerance: ±20%; Rated Current: 8.5A; Saturation Current (Isat): 9.5A; DC Resistance (DCR): 22mΩ; Type: 一体成型电感
LED2 = XL-1608SURC-06: 灯头类型:-;发光颜色:红色;正向压降(Vf):2.3V;功率:50mW;正向电流:20mA;波长:620nm~630nm;二极管配置:-;透镜颜色:无色透明透镜;色温:-;发光强度:225mcd;发光角度:120°;载带方式:正贴;工作温度:-40℃~+85℃;; LCSC Part Name: 0603红色贴片式发光二极管; Supplier Part: C965799; Manufacturer: XINGLIGHT(成兴光); Supplier Footprint: 0603; JLCPCB Part Class: 扩展库; Datasheet: https://item.szlcsc.com/datasheet/XL-1608SURC-06/1051408.html; Supplier: LCSC; Illumination Color: 红色; Voltage - Forward(Vf): 2.3V; Power(Watts): 50mW; Forward Current: 20mA; Wavelength - Dominant: 620nm~630nm; Peak Wavelength: 625nm; Lens Color: 无色透明透镜; Luminous Intensity: 225mcd; Viewing Angle: 120°; Mounting Style: 正贴; Operating Temperature: -40℃~+85℃
Q8 = XR60P03F: 数量:1个P沟道;漏源电压(Vdss):30V;连续漏极电流(Id):60A;导通电阻(RDS(on)):7.2mΩ@10V,30A;耗散功率(Pd):45W;阈值电压(Vgs(th)):1.5V;; LCSC Part Name: P沟道，30V快速开关MOSFET; Supplier Part: C42456946; Manufacturer: XNRUSEMI(新锐); Supplier Footprint: PDFN5060-8L; JLCPCB Part Class: 扩展库; Datasheet: https://item.szlcsc.com/datasheet/XR60P03F/44528036.html; Supplier: LCSC; Number: 1个P沟道; Drain to Source Voltage: 30V; Current - Continuous Drain(Id): 60A; RDS(on): 7.2mΩ@10V,30A; Pd - Power Dissipation: 45W; Gate Threshold Voltage (Vgs(th)): 1.5V; Gate Charge(Qg): 30nC@10V; Input Capacitance(Ciss): 2.396nF@15V; Reverse Transfer Capacitance (Crss@Vds): 283pF@15V; Operating Temperature: -55℃~+150℃; Type: P沟道; Output Capacitance(Coss): 325pF
R37 = RE2512F3R000L: 电阻类型:采样电阻；合金电阻;阻值:0Ω;精度:±1%;功率:3W;安装方式:贴片;; LCSC Part Name: 0mΩ 3W 2512 ±1%; Supplier Part: C46961764; Manufacturer: JIERR(捷而瑞); Supplier Footprint: 2512; JLCPCB Part Class: Extended Part; Datasheet: https://item.szlcsc.com/datasheet/RE2512F3R000L/49133303.html; Supplier: LCSC; Type: 采样电阻；合金电阻; Tolerance: ±1%; Power(Watts): 3W; Mounting Type: 贴片
R82 = RC0603FR-07649KL: 电阻类型:厚膜电阻;阻值:649kΩ;精度:±1%;功率:100mW;工作电压:75V;温度系数:±100ppm/℃;; LCSC Part Name: 厚膜电阻 649kΩ ±1% 100mW; Supplier Part: C245991; Manufacturer: YAGEO(国巨); Supplier Footprint: 0603; JLCPCB Part Class: Extended Part; Datasheet: https://item.szlcsc.com/datasheet/RC0603FR-07649KL/243492.html; Supplier: LCSC; Type: 厚膜电阻; Tolerance: ±1%; Power(Watts): 100mW; Voltage-Supply(Max): 75V; Temperature Coefficient: ±100ppm/℃; Operating Temperature: -55℃~+155℃
R83 = FRC0603F3R30TS: 电阻类型:厚膜电阻;阻值:3.3Ω;精度:±1%;功率:100mW;工作电压:75V;温度系数:±200ppm/℃;; LCSC Part Name: 3.3Ω ±1% 100mW 厚膜电阻; Supplier Part: C2930016; Manufacturer: FOJAN(富捷); Supplier Footprint: 0603; JLCPCB Part Class: Extended Part; Supplier: LCSC; Type: 厚膜电阻; Tolerance: ±1%; Power(Watts): 100mW; Voltage-Supply(Max): 75V; Temperature Coefficient: ±200ppm/℃; Operating Temperature: -55℃~+155℃
U2 = XT60-M.: 类别:-;类型1:-;; LCSC Part Name: AMASS(艾迈斯) XT60模型插头 3.5mm镀金香蕉头公头（电调端）XT60-M; Supplier Part: C98733; Manufacturer: AMASS(艾迈斯); JLCPCB Part Class: 扩展库; Datasheet: https://item.szlcsc.com/datasheet/XT60-M./99943.html; Supplier: LCSC; Type: 香蕉头; Colour: 黄色; InterfaceType: 公头; specifications: 3.5mm
U6 = XC6206P332MR_C347376: 输出类型:固定;工作电压:8V;输出电压:3.3V;输出电流:250mA;电源纹波抑制比(PSRR):40dB@(1kHz);输出极性:正极;; LCSC Part Name: 高纹波抑制率、低功耗、低压差 CMOS 降压型电压稳压器; Supplier Part: C347376; Manufacturer: UMW(友台半导体); Supplier Footprint: SOT-23; JLCPCB Part Class: 扩展库; Datasheet: https://item.szlcsc.com/datasheet/XC6206P332MR/324036.html; Supplier: LCSC; Output Type: 固定; Voltage - Supply: 8V; Output Voltage: 3.3V; Output Current: 250mA; Power Supply Rejection Ratio (PSRR): 40dB@(1kHz); Voltage Dropout: 240mV@(50mA); standby current: 7uA; Features: 过流保护；短路保护; Operating Temperature: -25℃~+80℃@(Ta); Output Configuration: 正极; Number of Outputs: 1
U12 = TPS56528DDAR: 功能类型:降压型;输出类型:可调;工作电压:4.5V~18V;输出电压:600mV~7V;输出电流:5A;; LCSC Part Name: 4.5V至18V输入，5A异步降压转换器; Supplier Part: C138716; Manufacturer: TI(德州仪器); Supplier Footprint: SOIC-8-EP; JLCPCB Part Class: Extended Part; Datasheet: https://www.ti.com/cn/lit/gpn/tps56528; Supplier: LCSC; Function: 降压型; Output Type: 可调; Voltage - Supply: 4.5V~18V; Output Voltage: 600mV~7V; Output Current: 5A; Frequency - Switching: 650kHz; Operating Temperature: -40℃~+85℃@(TA); Synchronous Rectifier: 是; Number of Outputs: 1; Topology: 降压式; Switch tube (built-in/external): 内置
U13 = 0451010.MRL: 类型:贴片式保险丝;额定电流:10A;额定电压 (AC):125V;额定电压:125V;分断能力:35A；50A;; LCSC Part Name: 125V贴片式保险丝; Supplier Part: C44479; Manufacturer: Littelfuse(美国力特); Supplier Footprint: 2410; JLCPCB Part Class: Extended Part; Datasheet: https://item.szlcsc.com/datasheet/0451010.MRL/45481.html; Supplier: LCSC; Type: 贴片式保险丝; Current Rating: 10A; Voltage Rating (AC): 125V; Voltage Rating (DC): 125V; Operating Temperature: -55℃~+125℃; Interrupt Rating: 35A；50A
U20 = VH3.96-4P ZZ: 插针结构:1x4P;间距:3.96mm;安装方式:直插;参考系列:VH;总PIN数:4P;排数:1;每排PIN数:4;行距:-;额定电流:7A;触头材质:黄铜;触头镀层:锡;工作温度:-25℃~+85℃;; LCSC Part Name: VH3.96-4P直针白色不耐温; Supplier Part: C5379870; Manufacturer: SHOU HAN(首韩); Supplier Footprint: 插件,P=3.96mm; JLCPCB Part Class: Extended Part; Datasheet: https://item.szlcsc.com/datasheet/VH3.96-4P%2520ZZ/6244978.html; Supplier: LCSC; Pins Structure: 1x4P; Pitch: 3.96mm; Mounting Type: 直插; Reference Series: VH; Number of Pins: 4P; Number of Rows: 1; Number of PINs Per Row: 4; Current Rating: 7A; Contact Material: 黄铜; Contact Plating: 锡; Operating Temperature: -25℃~+85℃; Voltage Rating: 250V; Plastic Material: PA66; Flame Retardant Rating: UL94V-0; Color: 白色
D18 = USBLC6-2SC6_C7519: 极性:单向;反向截止电压(Vrwm):5.25V;钳位电压:17V;峰值脉冲电流(Ipp):5A;击穿电压:6V;; LCSC Part Name: 单向ESD; Supplier Part: C7519; Manufacturer: ST(意法半导体); Supplier Footprint: SOT-23-6L; JLCPCB Part Class: 扩展库; Datasheet: https://item.szlcsc.com/datasheet/USBLC6-2SC6/7996.html; Supplier: LCSC; Polarity: 单向; Reverse Stand-Off Voltage (Vrwm): 5.25V; Clamping Voltage: 17V; Peak Pulse Current (Ipp): 5A; Voltage - Breakdown: 6V; Reverse Leakage Current (Ir): 150nA; Number of Channels: 双路; Operating Temperature: -40℃~+125℃; level of protection: IEC 61000-4-2; Type: ESD; Junction Capacitance: 3.5pF
R14 R15 = 0603WAF5101T5E: 电阻类型:厚膜电阻;阻值:5.1kΩ;精度:±1%;功率:100mW;工作电压:75V;温度系数:±100ppm/℃;; LCSC Part Name: 5.1kΩ ±1% 100mW 厚膜电阻; Supplier Part: C23186; Manufacturer: UNI-ROYAL(厚声); Supplier Footprint: 0603; JLCPCB Part Class: Basic Part; Datasheet: https://item.szlcsc.com/datasheet/0603WAF5101T5E/23913.html; Supplier: LCSC; Type: 厚膜电阻; Tolerance: ±1%; Power(Watts): 100mW; Voltage-Supply(Max): 75V; Temperature Coefficient: ±100ppm/℃; Operating Temperature: -55℃~+155℃
R63-R66 = FRC0603F33R0TS: 电阻类型:厚膜电阻;阻值:33Ω;精度:±1%;功率:100mW;工作电压:75V;温度系数:±100ppm/℃;; LCSC Part Name: 33Ω ±1% 100mW 厚膜电阻; Supplier Part: C2909394; Manufacturer: FOJAN(富捷); Supplier Footprint: 0603; JLCPCB Part Class: Extended Part; Supplier: LCSC; Type: 厚膜电阻; Tolerance: ±1%; Power(Watts): 100mW; Voltage-Supply(Max): 75V; Temperature Coefficient: ±100ppm/℃; Operating Temperature: -55℃~+155℃
USB1 = TYPE-C 16PIN 2MD(073): 连接器类型:Type-C;协议标准:-;公母:母;安装方式:卧贴;触点数量:16P;端口数量:1;额定电流 - 电源:3A;工作温度:-25℃~+85℃;; LCSC Part Name: Type-C 母 卧贴; Supplier Part: C2765186; Manufacturer: SHOU HAN(首韩); Supplier Footprint: SMD; JLCPCB Part Class: 扩展库; Datasheet: https://item.szlcsc.com/datasheet/TYPE-C%252016PIN%25202MD(073)/2901843.html; Supplier: LCSC; Connector Type: Type-C; Gender: 母; Mounting Type: 卧贴; Number of Contacts: 16P; Number of Ports: 1; Current Rating-Power: 3A; Voltage Rating: 5V; Connect-Disconnect Life: 5千次; Detection color: 黑色; Operating Temperature: -25℃~+85℃

## Nets
3V3: 3.3V.1 C2.2 C19.1 C20.1 C24.2 C112.2 C154.2 C155.2 C161.2 C162.2 C168.2 H1.5 L3.1 LED2.2(A) R2.2 R4.1 R6.2 R8.2 R53.2 R54.2 R67.2 R70.1 R72.2 R76.2 R77.2 R80.2 R81.2 U1.8(VCC) U3.3 U6.2(VOUT) U19.50(VDD) U19.75(VDD) U22.8(VDDIO) U22.13(VDD) U22.22(nCS) U23.2(AVDD) U23.13(DVDD) U24.8(VCC)
3V3_MCU: C18.2 C140.2 L3.2 L4.1 U19.11(VDD) U19.19(VDD) U19.28(VDD) U19.100(VDD)
5V0: C5.2 C6.2 C7.2 C8.2 C9.2 C10.2 C13.2 C17.1 C21.1 C25.2 C111.2 C192.2 C193.1 C194.2 C195.1 CN22.2 CN23.2 L1.1 R9.2 R21.2 R22.1 U4.3 U5.3 U6.3(VIN) U7.3 U8.3 U9.3 U10.3 U11.3
5VUSB: C164.2 C165.2 D18.5 USB1.2(VBUS) USB1.11(VBUS)
12V0: 12V0.1 C4.2 C12.2 C14.2 C22.2 C23.2 C26.2 C27.2 C28.2 C29.2 C127.2 C128.2 C129.1 C130.1 C131.2 C132.2 C189.2 CN3.2 Q8.5(D) Q8.6(D) Q8.7(D) Q8.8(D) Q8.9(D) R24.2 R39.2 U12.8(VIN) U20.2
12V0_IN: 12V0_IN.1 C11.2 D1.2(K) D2.2(K) Q8.1(S) Q8.2(S) Q8.3(S) R11.2
GND: C1.1 C2.1 C3.1 C4.1 C5.1 C6.1 C7.1 C8.1 C9.1 C10.1 C12.1 C14.1 C15.2 C17.2 C18.1 C19.2 C20.2 C21.2 C23.1 C24.1 C25.1 C26.1 C27.1 C28.1 C29.1 C30.1 C107.2 C108.2 C109.1 C110.1 C111.1 C112.1 C127.1 C128.1 C129.2 C130.2 C131.1 C132.1 C140.1 C145.1 C146.1 C147.1 C148.1 C149.1 C154.1 C155.1 C156.1 C161.1 C162.1 C163.1 C164.1 C165.1 C166.2 C167.2 C168.1 C169.1 C170.1 C171.1 C177.1 C189.1 C192.1 C193.2 C194.1 C195.2 CN22.1 CN23.1 D3.2 D4.2 D7.1 D16.1(K) D18.2 D19.2 D20.2 H1.2 Q1.2(E) Q2.2(E) Q3.2(S) Q4.2(E) R3.1 R5.2 R10.2 R14.1 R15.1 R16.1 R18.1 R21.1 R26.1 R37.1 R37.2 R38.1 R40.1 R41.1 R69.1 R71.2 R82.1 U1.4(DI) U1.5(GND) U2.1(-) U3.4 U4.4 U5.4 U6.1(VSS) U7.4 U8.4 U9.4 U10.4 U11.4 U12.5(GND) U12.9(EP) U19.10(VSS) U19.27(VSS) U19.74(VSS) U19.99(VSS) U20.1 U20.3 U22.9(SDO/AD0) U22.11(FSYNC) U22.18(GND) U22.20(RESV) U22.25(EP) U23.9(VSS) U23.11(VSS) U24.4(DI) U24.5(GND) USB1.1(GND) USB1.12(GND) X3.2(GND) X3.4(GND)
V1: U14.2
V2: U16.2
V3: U18.2
V4: U15.2
V5: U17.2
VDDA: C141.2 C142.2 L4.2 U19.21(VREF+) U19.22(VDDA)
AUX_CL: R81.1 U22.7(AUX_CL) U23.1(SCL)
AUX_DA: R80.1 U22.21(AUX_DA) U23.16(SDA)
BAT_A: CN12.2 F1.2 U4.1
BAT_ADC: BAT_TEST.1 C30.2 R39.1 R41.2 U19.18(PC3)
BAT_B: CN12.1 F2.2 U4.2
DRDY: R75.2 U19.3(PE4)
I2C2_SCL: R76.1 U3.2 U19.47(PB10)
I2C2_SDA: R77.1 U3.1 U19.48(PB11)
IMU_I2C1_SCL: R43.2 R54.1 U22.23(SCL/SCLK)
IMU_I2C1_SDA: R44.2 R53.1 U22.24(SDA/SDI)
KEY: C11.1 D7.2 D8.2(A) R11.1 R12.1 U20.4
LED_LEFT: U19.36(PB1)
LED_R: C22.1 CN3.1 Q3.3(D)
LED_RIGHT: C3.2 LED_RIGHT.1 Q2.1(B) R26.2 U19.35(PB0)
MOTO1_PWM_TIM3_CH1: C146.2 MOTO1_PWM.1 U19.31(PA6)
MOTO2_PWM_TIM1_CH1: C148.2 MOTO2_PWM.1 U19.67(PA8)
MOTO3_PWM_TIM2_CH1: C145.2 MOTO3_PWM.1 U19.30(PA5)
MOTO4_PWM_TIM1_CH3: C149.2 MOTO4_PWM.1 U19.69(PA10)
MOTO5_PWM_TIM1_CH2: C147.2 MOTO5_PWM.1 U19.68(PA9)
MOTO_LEFT: U19.53(PB14)
MOTO_RIGHT: U19.52(PB13)
NRST: H1.1 U19.14(NRST)
OTG_FS_DM: R65.1 U19.70(PA11)
OTG_FS_DP: R66.1 U19.71(PA12)
PB5: U22.12(INT)
PC10_UART4_TX: R1.1 U19.78(PC10)
PC11_UART4_RX: R8.1 U1.1(RO) U19.79(PC11)
PD5_UART2_TX_BAT: R68.1 U19.86(PD5)
PD6_UART2_RX_BAT: R2.1 U19.87(PD6) U24.1(RO)
RSTN: R74.2 U19.4(PE5)
SENSOR_A: F3.2 U5.1 U7.1 U8.1 U9.1 U10.1 U11.1
SENSOR_B: F4.2 U5.2 U7.2 U8.2 U9.2 U10.2 U11.2
SWCLK: H1.3 U19.76(PA14(JTCK-SWCLK))
SWDIO: H1.4 U19.72(PA13(JTMS-SWDIO))
USB3_D+: R63.2 USB1.6(DP1) USB1.8(DP2)
USB3_D-: R64.1 USB1.5(DN2) USB1.7(DN1)
W1: U14.3
W2: U16.3
W3: U18.3
W4: U15.3
W5: U17.3
Y1: U14.1
Y2: U16.1
Y3: U18.1
Y4: U15.1
Y5: U17.1
$3N697: C107.1 U19.8(PC14-OSC32_IN(PC14)) X2.2(OSC2)
$3N698: C108.1 U19.9(PC15-OSC32_OUT(PC15)) X2.1(OSC1)
$3N900: C109.2 U19.12(PH0-OSC_IN(PH0)) X3.3
$3N913: C110.2 U19.13(PH1-OSC_OUT(PH1)) X3.1
$3N1102: R18.2 U19.94(BOOT0)
$3N27755: C141.1 C142.1 R38.2 U19.20(VSSA)
$3N37466: R40.2 U19.37(PB2-BOOT1(PB2))
$3N37958: R44.1 U19.93(PB7)
$3N37962: R43.1 U19.92(PB6)
$3N43765: C166.1 U19.73(VCAP_2)
$3N43824: C167.1 U19.49(VCAP_1)
$4N5491: D18.6 R63.1
$4N5566: D18.4 R64.2
$4N5769: D18.1 R66.2 R67.1
$4N5773: D18.3 R65.2
$4N5919: R14.2 USB1.10(CC2)
$4N5920: R15.2 USB1.4(CC1)
$5N582: Q1.3(C) R70.2 U24.2(#RE) U24.3(DE)
$5N1333: D19.1 D21.2 F2.1 R71.1 R73.2 U24.7(B)
$5N1784: D20.1 D21.1 F1.1 R72.1 R73.1 U24.6(A)
$5N3154: C169.2 U25.1
$5N3161: C170.2 U26.1
$5N3166: C171.2 U27.1
$5N6846: Q1.1(B) R68.2 R69.2
$5N6850: C1.2 U28.1
$5N6855: D4.1 D5.1 F3.1 R6.1 R7.1 U1.6(A)
$5N6860: D3.1 D5.2 F4.1 R5.1 R7.2 U1.7(B)
$5N6865: Q4.1(B) R1.2 R3.2
$5N6867: Q4.3(C) R4.2 U1.2(#RE) U1.3(DE)
$5N6961: Q2.3(C) Q3.1(G) R9.1 R10.1
$6N447: C156.2 U22.10(REGOUT)
$6N1099: C163.2 U23.10(C1)
$6N2109: R74.1 U23.14(RSTN)
$6N2149: R75.1 U23.15(DRDY)
$9N4816: LED2.1(K) R16.2
$9N50400: D8.1(C) Q8.4(G) R12.2
$9N50406: D1.1(A) D1.3(A) D2.1(A) D2.3(A) D16.2(A) R82.2 R83.2 U13.2
$9N50407: U2.2(+) U13.1
$9N50408: C177.2 R83.1
$9N50410: C13.1 R22.2 U12.2(VFB)
$9N50412: C15.1 R23.1 U12.3(VREG5)
$9N50413: R23.2 U12.4(PG)
$9N50415: C16.2 U12.7(VBST)
$9N50416: C16.1 L1.2 U12.6(SW)
$9N50420: R24.1 U12.1(EN)

Not connected (* = marked no-connect by the designer): U19 1(PE2) 2(PE3) 5(PE6) 6(VBAT) 7(PC13) 15(PC0)* 16(PC1)* 17(PC2)* 23(PA0-WKUP(PA0))* 24(PA1)* 25(PA2) 26(PA3) 29(PA4)* 32(PA7) 33(PC4) 34(PC5) 38(PE7) 39(PE8) 40(PE9) 41(PE10) 42(PE11) 43(PE12) 44(PE13) 45(PE14) 46(PE15) 51(PB12) 54(PB15) 55(PD8) 56(PD9) 57(PD10) 58(PD11) 59(PD12) 60(PD13) 61(PD14) 62(PD15) 63(PC6) 64(PC7) 65(PC8) 66(PC9) 77(PA15(JTDI))* 80(PC12) 81(PD0) 82(PD1) 83(PD2) 84(PD3) 85(PD4) 88(PD7) 89(PB3(JTDOTRACESWO)) 90(PB4(NJTRST)) 91(PB5) 95(PB8) 96(PB9) 97(PE0) 98(PE1); U22 1(NC)* 2(NC)* 3(NC)* 4(NC)* 5(NC)* 6(NC)* 14(NC)* 15(NC)* 16(NC)* 17(NC)* 19(RESV); U23 3(NC)* 4(NC)* 5(CAD0)* 6(CAD1)* 7(VPP)* 8(NC)* 12(NC)*; USB1 3(SBU2) 9(SBU1) 13(SHELL) 14(SHELL)

## Notes on the sheets
sheet 1
- 左电机
- 右电机
- 深度电机
- 深度电机
- 深度电机
- CL=12.5pF
sheet 2
- USB
sheet 3
- 超声波传感器485
- 电池485通信
- 温度传感器
- 深度传感器
- LED探照灯
- 电调接口
sheet 4
- IIC Address:0X0E
sheet 5
- 输入
- 此处选取pmos作为开关管
- 二极管有0.3v的压降
- 开关
- 12V
- 5V
- 5A
- 电池电压：12.6V到8.5V，将9.5V设为返航电压，减去二极管的0.5v压降，则此时为9.0V电压
- 5V
- 3.3V
- 1%
- 1%
- 满载电压：12.6*(27/127)=2.678V
  返航电压：9*（27/127)=1.9133V
- 单点接地
